# Altium project T3-COM1-2.PrjPcb (part 3 of 6)

## Sheet Schematic1_2.SchDoc
size 594 x 420 mm; SchematicName: Schematic1; PageName: 2; CmpIndex: 3; Symbol name: A2-LIST-2N-1-GA.1; SymIndex: 3
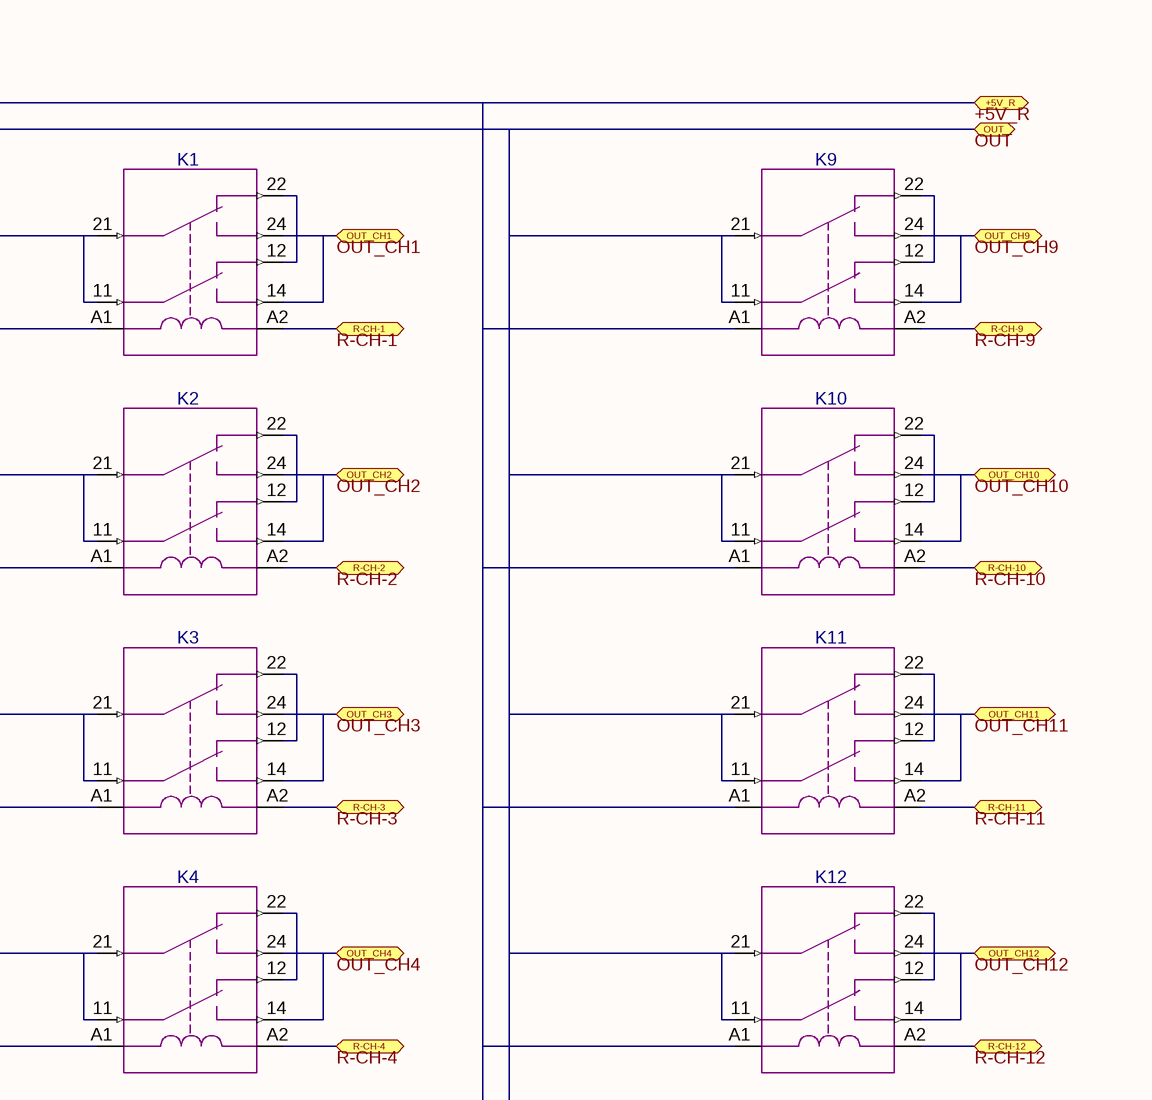
[diagram p5: Schematic1_2.SchDoc, top left]
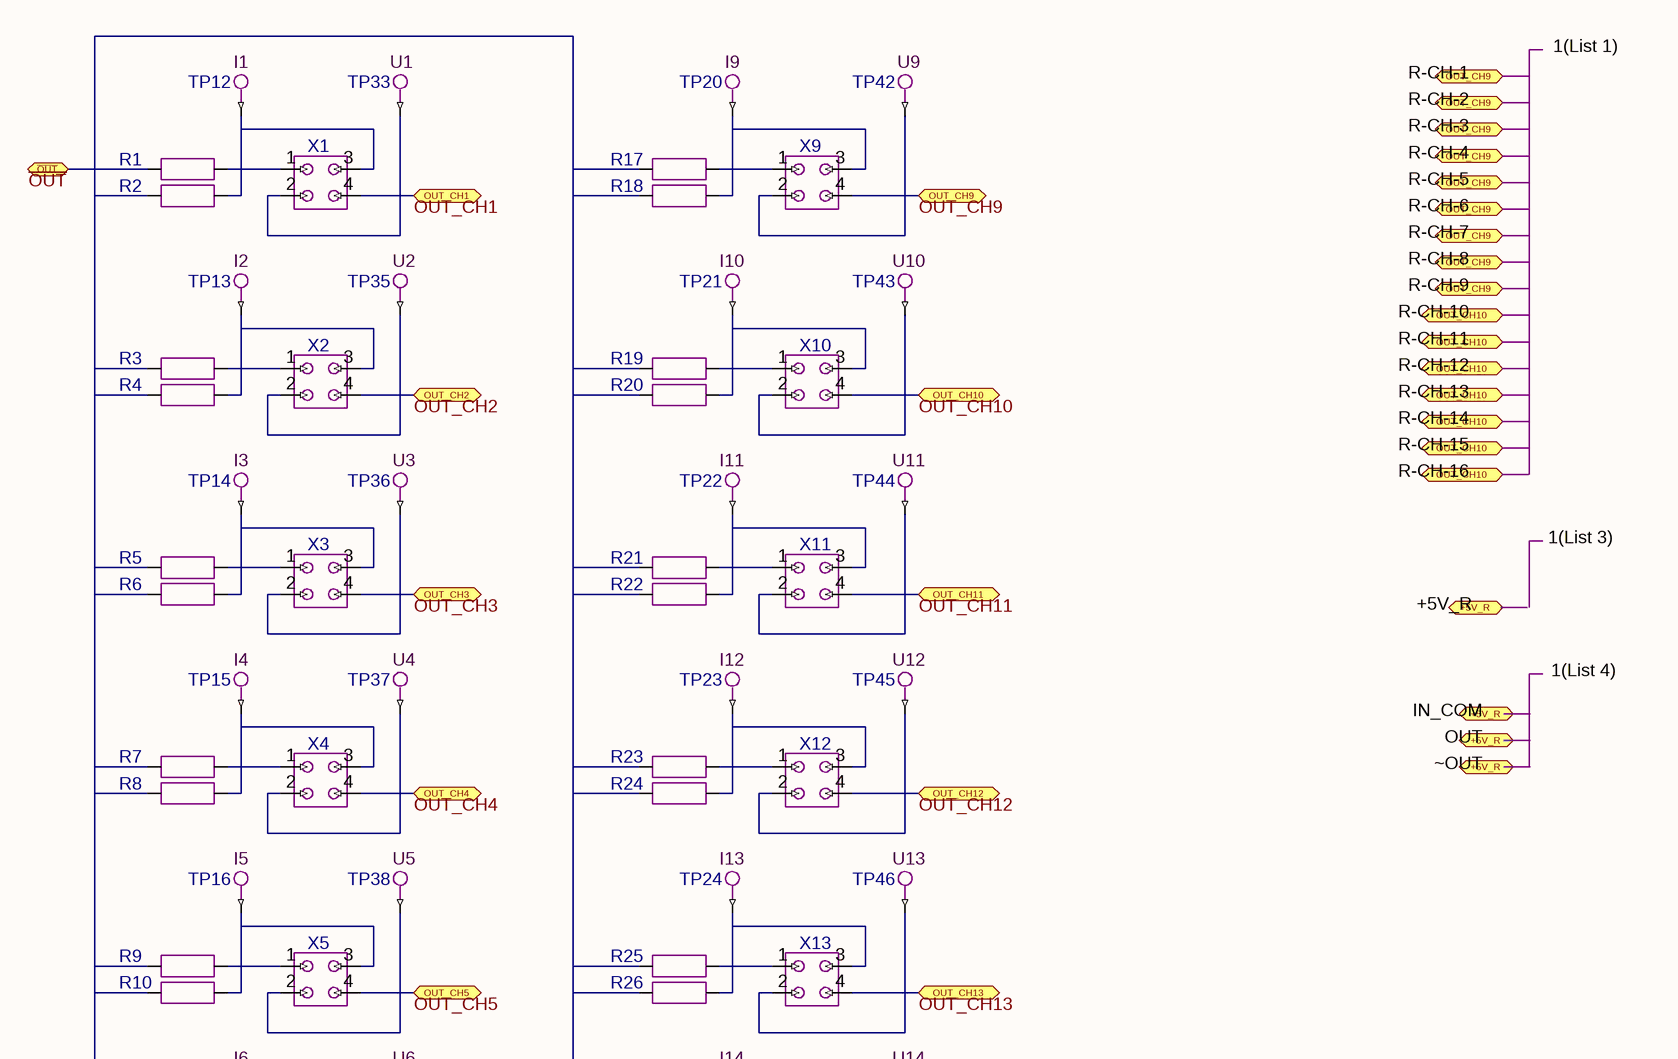
[diagram p6: Schematic1_2.SchDoc, top right]
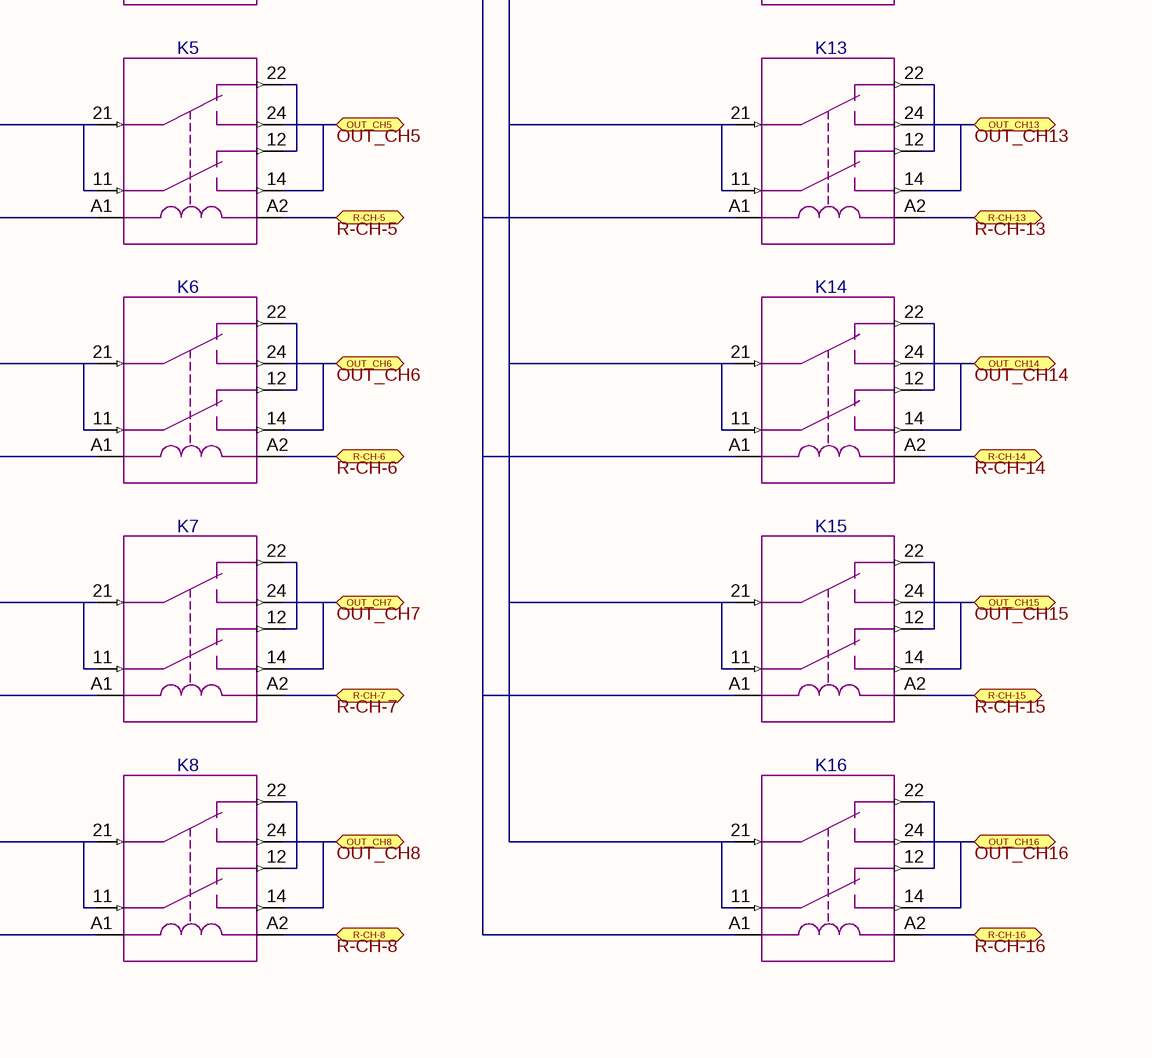
[diagram p7: Schematic1_2.SchDoc, bottom left]
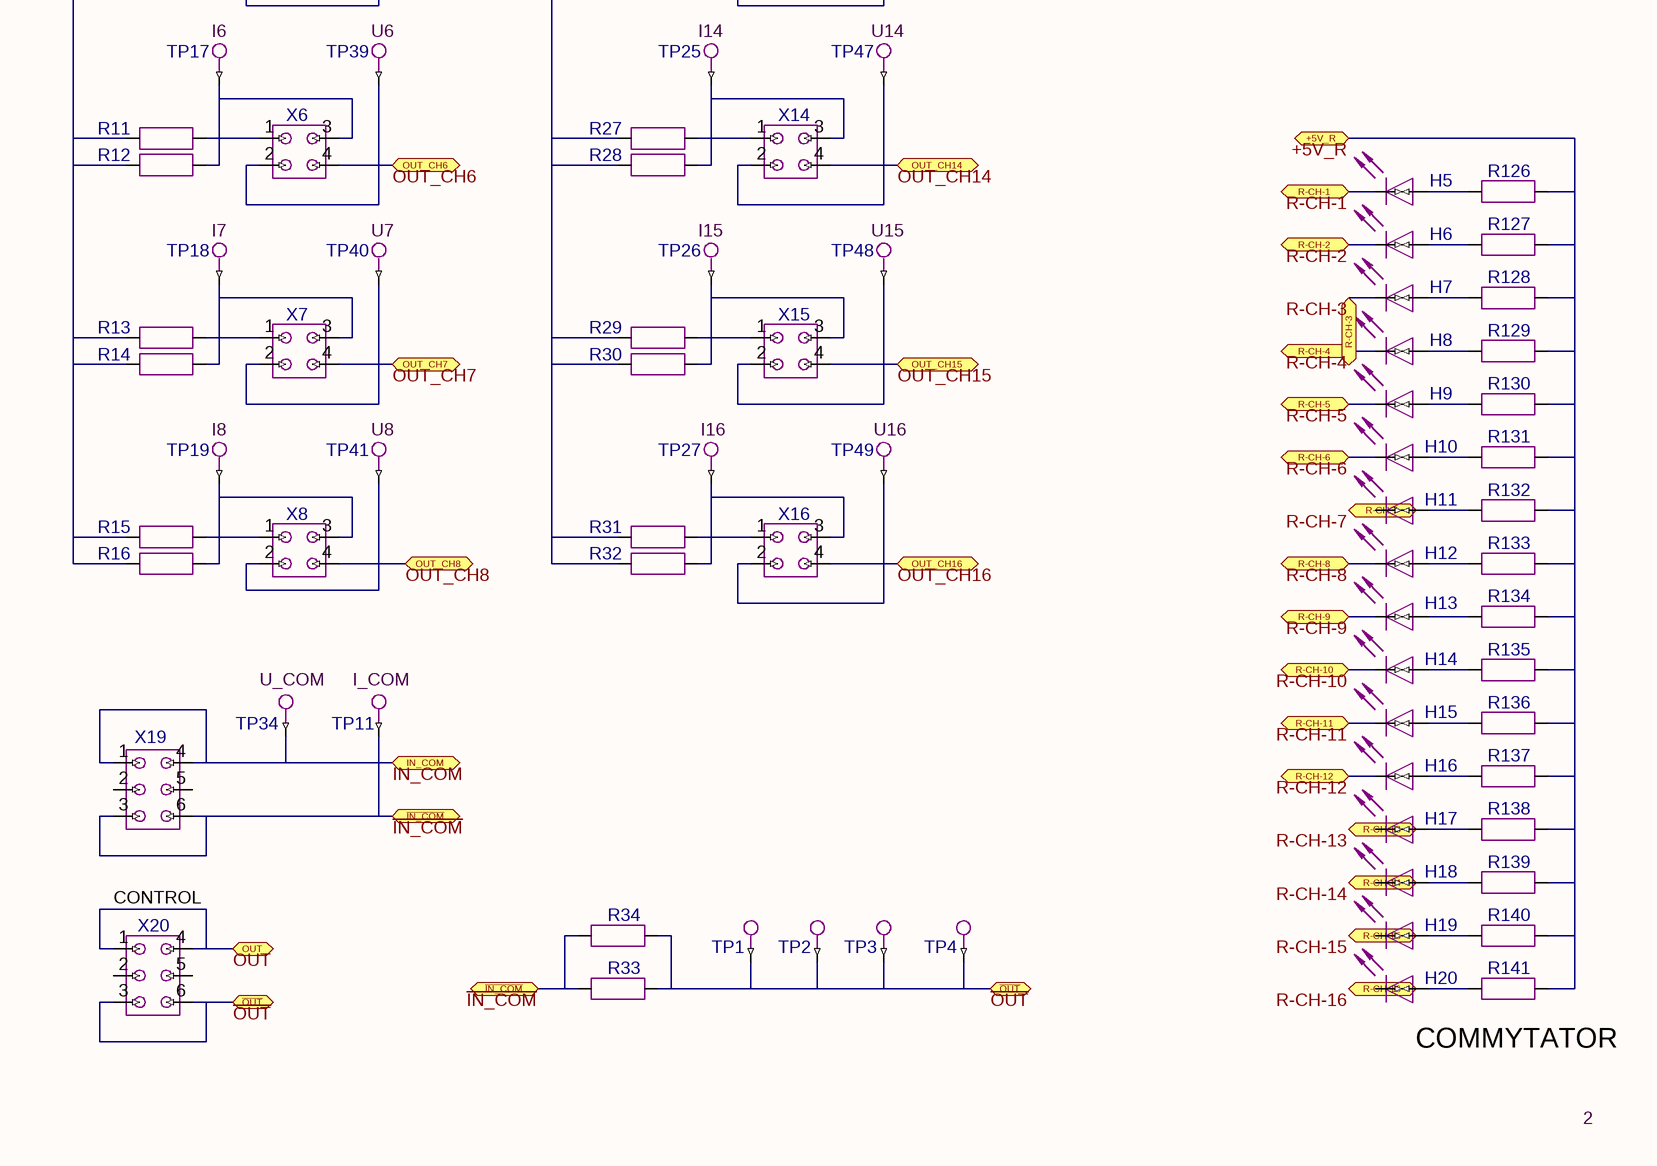
[diagram p8: Schematic1_2.SchDoc, bottom right]

### Parts
H5  LED 2X1.2MM 640NM RD WTR CLR SMD  (value not drawn)
H6  LED 2X1.2MM 640NM RD WTR CLR SMD  (value not drawn)
H7  LED 2X1.2MM 640NM RD WTR CLR SMD  (value not drawn)
H8  LED 2X1.2MM 640NM RD WTR CLR SMD  (value not drawn)
H9  LED 2X1.2MM 640NM RD WTR CLR SMD  (value not drawn)
H10  LED 2X1.2MM 640NM RD WTR CLR SMD  (value not drawn)
H11  LED 2X1.2MM 640NM RD WTR CLR SMD  (value not drawn)
H12  LED 2X1.2MM 640NM RD WTR CLR SMD  (value not drawn)
H13  LED 2X1.2MM 640NM RD WTR CLR SMD  (value not drawn)
H14  LED 2X1.2MM 640NM RD WTR CLR SMD  (value not drawn)
H15  LED 2X1.2MM 640NM RD WTR CLR SMD  (value not drawn)
H16  LED 2X1.2MM 640NM RD WTR CLR SMD  (value not drawn)
H17  LED 2X1.2MM 640NM RD WTR CLR SMD  (value not drawn)
H18  LED 2X1.2MM 640NM RD WTR CLR SMD  (value not drawn)
H19  LED 2X1.2MM 640NM RD WTR CLR SMD  (value not drawn)
H20  LED 2X1.2MM 640NM RD WTR CLR SMD  (value not drawn)
K1  RELAY GEN PURPOSE SPDT 16A 5V  (value not drawn)
K2  RELAY GEN PURPOSE SPDT 16A 5V  (value not drawn)
K3  RELAY GEN PURPOSE SPDT 16A 5V  (value not drawn)
K4  RELAY GEN PURPOSE SPDT 16A 5V  (value not drawn)
K5  RELAY GEN PURPOSE SPDT 16A 5V  (value not drawn)
K6  RELAY GEN PURPOSE SPDT 16A 5V  (value not drawn)
K7  RELAY GEN PURPOSE SPDT 16A 5V  (value not drawn)
K8  RELAY GEN PURPOSE SPDT 16A 5V  (value not drawn)
K9  RELAY GEN PURPOSE SPDT 16A 5V  (value not drawn)
K10  RELAY GEN PURPOSE SPDT 16A 5V  (value not drawn)
K11  RELAY GEN PURPOSE SPDT 16A 5V  (value not drawn)
K12  RELAY GEN PURPOSE SPDT 16A 5V  (value not drawn)
K13  RELAY GEN PURPOSE SPDT 16A 5V  (value not drawn)
K14  RELAY GEN PURPOSE SPDT 16A 5V  (value not drawn)
K15  RELAY GEN PURPOSE SPDT 16A 5V  (value not drawn)
K16  RELAY GEN PURPOSE SPDT 16A 5V  (value not drawn)
R1  RES 0.1 OHM 1% 2W 2512  (value not drawn)
R2  RES 0.1 OHM 1% 2W 2512  (value not drawn)
R3  RES 0.1 OHM 1% 2W 2512  (value not drawn)
R4  RES 0.1 OHM 1% 2W 2512  (value not drawn)
R5  RES 0.1 OHM 1% 2W 2512  (value not drawn)
R6  RES 0.1 OHM 1% 2W 2512  (value not drawn)
R7  RES 0.1 OHM 1% 2W 2512  (value not drawn)
R8  RES 0.1 OHM 1% 2W 2512  (value not drawn)
R9  RES 0.1 OHM 1% 2W 2512  (value not drawn)
R10  RES 0.1 OHM 1% 2W 2512  (value not drawn)
R11  RES 0.1 OHM 1% 2W 2512  (value not drawn)
R12  RES 0.1 OHM 1% 2W 2512  (value not drawn)
R13  RES 0.1 OHM 1% 2W 2512  (value not drawn)
R14  RES 0.1 OHM 1% 2W 2512  (value not drawn)
R15  RES 0.1 OHM 1% 2W 2512  (value not drawn)
R16  RES 0.1 OHM 1% 2W 2512  (value not drawn)
R17  RES 0.1 OHM 1% 2W 2512  (value not drawn)
R18  RES 0.1 OHM 1% 2W 2512  (value not drawn)
R19  RES 0.1 OHM 1% 2W 2512  (value not drawn)
R20  RES 0.1 OHM 1% 2W 2512  (value not drawn)
R21  RES 0.1 OHM 1% 2W 2512  (value not drawn)
R22  RES 0.1 OHM 1% 2W 2512  (value not drawn)
R23  RES 0.1 OHM 1% 2W 2512  (value not drawn)
R24  RES 0.1 OHM 1% 2W 2512  (value not drawn)
R25  RES 0.1 OHM 1% 2W 2512  (value not drawn)
R26  RES 0.1 OHM 1% 2W 2512  (value not drawn)
R27  RES 0.1 OHM 1% 2W 2512  (value not drawn)
R28  RES 0.1 OHM 1% 2W 2512  (value not drawn)
R29  RES 0.1 OHM 1% 2W 2512  (value not drawn)
R30  RES 0.1 OHM 1% 2W 2512  (value not drawn)
R31  RES 0.1 OHM 1% 2W 2512  (value not drawn)
R32  RES 0.1 OHM 1% 2W 2512  (value not drawn)
R33  RES 0.1 OHM 1% 2W 2512  (value not drawn)
R34  RES 0.1 OHM 1% 2W 2512  (value not drawn)
R126  RES 620 OHM 1/10W 1% 0603 SMD  (value not drawn)
R127  RES 620 OHM 1/10W 1% 0603 SMD  (value not drawn)
R128  RES 620 OHM 1/10W 1% 0603 SMD  (value not drawn)
R129  RES 620 OHM 1/10W 1% 0603 SMD  (value not drawn)
R130  RES 620 OHM 1/10W 1% 0603 SMD  (value not drawn)
R131  RES 620 OHM 1/10W 1% 0603 SMD  (value not drawn)
R132  RES 620 OHM 1/10W 1% 0603 SMD  (value not drawn)
R133  RES 620 OHM 1/10W 1% 0603 SMD  (value not drawn)
R134  RES 620 OHM 1/10W 1% 0603 SMD  (value not drawn)
R135  RES 620 OHM 1/10W 1% 0603 SMD  (value not drawn)
R136  RES 620 OHM 1/10W 1% 0603 SMD  (value not drawn)
R137  RES 620 OHM 1/10W 1% 0603 SMD  (value not drawn)
R138  RES 620 OHM 1/10W 1% 0603 SMD  (value not drawn)
R139  RES 620 OHM 1/10W 1% 0603 SMD  (value not drawn)
R140  RES 620 OHM 1/10W 1% 0603 SMD  (value not drawn)
R141  RES 620 OHM 1/10W 1% 0603 SMD  (value not drawn)
TP1  TEST POINT PC MULTI PURPOSE BLK  (value not drawn)
TP2  TEST POINT PC MULTI PURPOSE BLK  (value not drawn)
TP3  TEST POINT PC MULTI PURPOSE BLK  (value not drawn)
TP4  TEST POINT PC MULTI PURPOSE BLK  (value not drawn)
TP11  TEST POINT PC MULTIPURPOSE BRWN  (value not drawn)
TP12  TEST POINT PC MULTIPURPOSE BRWN  (value not drawn)
TP13  TEST POINT PC MULTIPURPOSE BRWN  (value not drawn)
TP14  TEST POINT PC MULTIPURPOSE BRWN  (value not drawn)
TP15  TEST POINT PC MULTIPURPOSE BRWN  (value not drawn)
TP16  TEST POINT PC MULTIPURPOSE BRWN  (value not drawn)
TP17  TEST POINT PC MULTIPURPOSE BRWN  (value not drawn)
TP18  TEST POINT PC MULTIPURPOSE BRWN  (value not drawn)
TP19  TEST POINT PC MULTIPURPOSE BRWN  (value not drawn)
TP20  TEST POINT PC MULTIPURPOSE BRWN  (value not drawn)
TP21  TEST POINT PC MULTIPURPOSE BRWN  (value not drawn)
TP22  TEST POINT PC MULTIPURPOSE BRWN  (value not drawn)
TP23  TEST POINT PC MULTIPURPOSE BRWN  (value not drawn)
TP24  TEST POINT PC MULTIPURPOSE BRWN  (value not drawn)
TP25  TEST POINT PC MULTIPURPOSE BRWN  (value not drawn)
TP26  TEST POINT PC MULTIPURPOSE BRWN  (value not drawn)
TP27  TEST POINT PC MULTIPURPOSE BRWN  (value not drawn)
TP33  TEST POINT PC MULTI PURPOSE ORG  (value not drawn)
TP34  TEST POINT PC MULTI PURPOSE ORG  (value not drawn)
TP35  TEST POINT PC MULTI PURPOSE ORG  (value not drawn)
TP36  TEST POINT PC MULTI PURPOSE ORG  (value not drawn)
TP37  TEST POINT PC MULTI PURPOSE ORG  (value not drawn)
TP38  TEST POINT PC MULTI PURPOSE ORG  (value not drawn)
TP39  TEST POINT PC MULTI PURPOSE ORG  (value not drawn)
TP40  TEST POINT PC MULTI PURPOSE ORG  (value not drawn)
TP41  TEST POINT PC MULTI PURPOSE ORG  (value not drawn)
TP42  TEST POINT PC MULTI PURPOSE ORG  (value not drawn)
TP43  TEST POINT PC MULTI PURPOSE ORG  (value not drawn)
TP44  TEST POINT PC MULTI PURPOSE ORG  (value not drawn)
TP45  TEST POINT PC MULTI PURPOSE ORG  (value not drawn)
TP46  TEST POINT PC MULTI PURPOSE ORG  (value not drawn)
TP47  TEST POINT PC MULTI PURPOSE ORG  (value not drawn)
TP48  TEST POINT PC MULTI PURPOSE ORG  (value not drawn)
TP49  TEST POINT PC MULTI PURPOSE ORG  (value not drawn)
X1  CONN HEADER 4POS 4.2MM R/A TIN  (value not drawn)
X2  CONN HEADER 4POS 4.2MM R/A TIN  (value not drawn)
X3  CONN HEADER 4POS 4.2MM R/A TIN  (value not drawn)
X4  CONN HEADER 4POS 4.2MM R/A TIN  (value not drawn)
X5  CONN HEADER 4POS 4.2MM R/A TIN  (value not drawn)
X6  CONN HEADER 4POS 4.2MM R/A TIN  (value not drawn)
X7  CONN HEADER 4POS 4.2MM R/A TIN  (value not drawn)
X8  CONN HEADER 4POS 4.2MM R/A TIN  (value not drawn)
X9  CONN HEADER 4POS 4.2MM R/A TIN  (value not drawn)
X10  CONN HEADER 4POS 4.2MM R/A TIN  (value not drawn)
X11  CONN HEADER 4POS 4.2MM R/A TIN  (value not drawn)
X12  CONN HEADER 4POS 4.2MM R/A TIN  (value not drawn)
X13  CONN HEADER 4POS 4.2MM R/A TIN  (value not drawn)
X14  CONN HEADER 4POS 4.2MM R/A TIN  (value not drawn)
X15  CONN HEADER 4POS 4.2MM R/A TIN  (value not drawn)
X16  CONN HEADER 4POS 4.2MM R/A TIN  (value not drawn)
X19  CONN HEADER 6POS 4.2MM VERT TIN  (value not drawn)
X20  CONN HEADER 6POS 4.2MM VERT TIN  (value not drawn)

### Ports
+5V_R, IN_COM, OUT, OUT_CH1, OUT_CH2, OUT_CH3, OUT_CH4, OUT_CH5, OUT_CH6, OUT_CH7, OUT_CH8, OUT_CH9, OUT_CH10, OUT_CH11, OUT_CH12, OUT_CH13, OUT_CH14, OUT_CH15, OUT_CH16, R-CH-1, R-CH-2, R-CH-3, R-CH-4, R-CH-5, R-CH-6, R-CH-7, R-CH-8, R-CH-9, R-CH-10, R-CH-11, R-CH-12, R-CH-13, R-CH-14, R-CH-15, R-CH-16, ~{IN_COM}, ~{OUT}

### Nets
+5V_R: K1.A1 K2.A1 K3.A1 K4.A1 K5.A1 K6.A1 K7.A1 K8.A1 K9.A1 K10.A1 K11.A1 K12.A1 K13.A1 K14.A1 K15.A1 K16.A1 R126.2 R127.2 R128.2 R129.2 R130.2 R131.2 R132.2 R133.2 R134.2 R135.2 R136.2 R137.2 R138.2 R139.2 R140.2 R141.2 ; port +5V_R
~{IN_COM}: R33.1 R34.1 TP11.1 X19.3 X19.6 ; port ~{IN_COM}
IN_COM: TP34.1 X19.1 X19.4 ; port IN_COM
~{OUT}: R1.1 R2.1 R3.1 R4.1 R5.1 R6.1 R7.1 R8.1 R9.1 R10.1 R11.1 R12.1 R13.1 R14.1 R15.1 R16.1 R17.1 R18.1 R19.1 R20.1 R21.1 R22.1 R23.1 R24.1 R25.1 R26.1 R27.1 R28.1 R29.1 R30.1 R31.1 R32.1 R33.2 R34.2 TP1.1 TP2.1 TP3.1 TP4.1 X20.3 X20.6 ; port ~{OUT}
OUT: K1.11(K11) K1.21(K21) K2.11(K11) K2.21(K21) K3.11(K11) K3.21(K21) K4.11(K11) K4.21(K21) K5.11(K11) K5.21(K21) K6.11(K11) K6.21(K21) K7.11(K11) K7.21(K21) K8.11(K11) K8.21(K21) K9.11(K11) K9.21(K21) K10.11(K11) K10.21(K21) K11.11(K11) K11.21(K21) K12.11(K11) K12.21(K21) K13.11(K11) K13.21(K21) K14.11(K11) K14.21(K21) K15.11(K11) K15.21(K21) K16.11(K11) K16.21(K21) X20.1 X20.4 ; port OUT
OUT_CH1: K1.14(K14) K1.24(K24) TP33.1 X1.2 X1.4 ; port OUT_CH1
OUT_CH2: K2.14(K14) K2.24(K24) TP35.1 X2.2 X2.4 ; port OUT_CH2
OUT_CH3: K3.14(K14) K3.24(K24) TP36.1 X3.2 X3.4 ; port OUT_CH3
OUT_CH4: K4.14(K14) K4.24(K24) TP37.1 X4.2 X4.4 ; port OUT_CH4
OUT_CH5: K5.14(K14) K5.24(K24) TP38.1 X5.2 X5.4 ; port OUT_CH5
OUT_CH6: K6.14(K14) K6.24(K24) TP39.1 X6.2 X6.4 ; port OUT_CH6
OUT_CH7: K7.14(K14) K7.24(K24) TP40.1 X7.2 X7.4 ; port OUT_CH7
OUT_CH8: K8.14(K14) K8.24(K24) TP41.1 X8.2 X8.4 ; port OUT_CH8
OUT_CH9: K9.14(K14) K9.24(K24) TP42.1 X9.2 X9.4 ; port OUT_CH9
OUT_CH10: K10.14(K14) K10.24(K24) TP43.1 X10.2 X10.4 ; port OUT_CH10
OUT_CH11: K11.14(K14) K11.24(K24) TP44.1 X11.2 X11.4 ; port OUT_CH11
OUT_CH12: K12.14(K14) K12.24(K24) TP45.1 X12.2 X12.4 ; port OUT_CH12
OUT_CH13: K13.14(K14) K13.24(K24) TP46.1 X13.2 X13.4 ; port OUT_CH13
OUT_CH14: K14.14(K14) K14.24(K24) TP47.1 X14.2 X14.4 ; port OUT_CH14
OUT_CH15: K15.14(K14) K15.24(K24) TP48.1 X15.2 X15.4 ; port OUT_CH15
OUT_CH16: K16.14(K14) K16.24(K24) TP49.1 X16.2 X16.4 ; port OUT_CH16
R-CH-1: H5.2(C) K1.A2 ; port R-CH-1
R-CH-2: H6.2(C) K2.A2 ; port R-CH-2
R-CH-3: H7.2(C) K3.A2 ; port R-CH-3
R-CH-4: H8.2(C) K4.A2 ; port R-CH-4
R-CH-5: H9.2(C) K5.A2 ; port R-CH-5
R-CH-6: H10.2(C) K6.A2 ; port R-CH-6
R-CH-7: H11.2(C) K7.A2 ; port R-CH-7
R-CH-8: H12.2(C) K8.A2 ; port R-CH-8
R-CH-9: H13.2(C) K9.A2 ; port R-CH-9
R-CH-10: H14.2(C) K10.A2 ; port R-CH-10
R-CH-11: H15.2(C) K11.A2 ; port R-CH-11
R-CH-12: H16.2(C) K12.A2 ; port R-CH-12
R-CH-13: H17.2(C) K13.A2 ; port R-CH-13
R-CH-14: H18.2(C) K14.A2 ; port R-CH-14
R-CH-15: H19.2(C) K15.A2 ; port R-CH-15
R-CH-16: H20.2(C) K16.A2 ; port R-CH-16
NetH5_1: H5.1(A) R126.1
NetH6_1: H6.1(A) R127.1
NetH7_1: H7.1(A) R128.1
NetH8_1: H8.1(A) R129.1
NetH9_1: H9.1(A) R130.1
NetH10_1: H10.1(A) R131.1
NetH11_1: H11.1(A) R132.1
NetH12_1: H12.1(A) R133.1
NetH13_1: H13.1(A) R134.1
NetH14_1: H14.1(A) R135.1
NetH15_1: H15.1(A) R136.1
NetH16_1: H16.1(A) R137.1
NetH17_1: H17.1(A) R138.1
NetH18_1: H18.1(A) R139.1
NetH19_1: H19.1(A) R140.1
NetH20_1: H20.1(A) R141.1
NetK1_12: K1.12(K12) K1.22(K22)
NetK2_12: K2.12(K12) K2.22(K22)
NetK3_12: K3.12(K12) K3.22(K22)
NetK4_12: K4.12(K12) K4.22(K22)
NetK5_12: K5.12(K12) K5.22(K22)
NetK6_12: K6.12(K12) K6.22(K22)
NetK7_12: K7.12(K12) K7.22(K22)
NetK8_12: K8.12(K12) K8.22(K22)
NetK9_12: K9.12(K12) K9.22(K22)
NetK10_12: K10.12(K12) K10.22(K22)
NetK11_12: K11.12(K12) K11.22(K22)
NetK12_12: K12.12(K12) K12.22(K22)
NetK13_12: K13.12(K12) K13.22(K22)
NetK14_12: K14.12(K12) K14.22(K22)
NetK15_12: K15.12(K12) K15.22(K22)
NetK16_12: K16.12(K12) K16.22(K22)
NetR1_2: R1.2 R2.2 TP12.1 X1.1 X1.3
NetR3_2: R3.2 R4.2 TP13.1 X2.1 X2.3
NetR5_2: R5.2 R6.2 TP14.1 X3.1 X3.3
NetR7_2: R7.2 R8.2 TP15.1 X4.1 X4.3
NetR9_2: R9.2 R10.2 TP16.1 X5.1 X5.3
NetR11_2: R11.2 R12.2 TP17.1 X6.1 X6.3
NetR13_2: R13.2 R14.2 TP18.1 X7.1 X7.3
NetR15_2: R15.2 R16.2 TP19.1 X8.1 X8.3
NetR17_2: R17.2 R18.2 TP20.1 X9.1 X9.3
NetR19_2: R19.2 R20.2 TP21.1 X10.1 X10.3
NetR21_2: R21.2 R22.2 TP22.1 X11.1 X11.3
NetR23_2: R23.2 R24.2 TP23.1 X12.1 X12.3
NetR25_2: R25.2 R26.2 TP24.1 X13.1 X13.3
NetR27_2: R27.2 R28.2 TP25.1 X14.1 X14.3
NetR29_2: R29.2 R30.2 TP26.1 X15.1 X15.3
NetR31_2: R31.2 R32.2 TP27.1 X16.1 X16.3

Not connected (* = marked no-connect by the designer): X19 2 5; X20 2 5

### Notes on the sheet
- 1(List 1)
- (near TP12) I1
- (near TP33) U1
- (near TP20) I9
- (near TP42) U9
- R-CH-1
- R-CH-2
- R-CH-3
- R-CH-4
- R-CH-5
- R-CH-6
- R-CH-7
- (near TP13) I2
- (near TP35) U2
- (near TP21) I10
- (near TP43) U10
- R-CH-8
- R-CH-9
- R-CH-10
- R-CH-11
- R-CH-12
- R-CH-13
- R-CH-14
- R-CH-15
- (near TP14) I3
- (near TP36) U3
- (near TP22) I11
- (near TP44) U11
- R-CH-16
- 1(List 3)
- +5V_R
- (near TP15) I4
- (near TP37) U4
- (near TP23) I12
- (near TP45) U12
- IN_COM
- 1(List 4)
- OUT
- ~OUT
- (near TP16) I5
- (near TP38) U5
- (near TP24) I13
- (near TP46) U13
- (near TP17) I6
- (near TP39) U6
- (near TP25) I14
- (near TP47) U14
- (near TP18) I7
- (near TP40) U7
- (near TP26) I15
- (near TP48) U15
- (near TP19) I8
- (near TP41) U8
- (near TP27) I16
- (near TP49) U16
- (near TP34) U_COM
- (near TP11) I_COM
- (near X20) CONTROL
- COMMYTATOR
- 2

### Library data of the parts
H5 = LED 2X1.2MM 640NM RD WTR CLR SMD: APT2012SRCPRV; Part Label: RED/20mA/100mcd; Cell Name: 0805-STANDART-2012-SVET; CmpIndex: 65; Ref Designator: H5; Symbol name: SVETODIODE_1A_2K.1; SymIndex: 16; Part Name: LED 2X1.2MM 640NM RD WTR CLR SMD; Part Number: APT2012SRCPRV
H6 = LED 2X1.2MM 640NM RD WTR CLR SMD: APT2012SRCPRV; Part Label: RED/20mA/100mcd; Cell Name: 0805-STANDART-2012-SVET; CmpIndex: 100; Ref Designator: H6; Symbol name: SVETODIODE_1A_2K.1; SymIndex: 16; Part Name: LED 2X1.2MM 640NM RD WTR CLR SMD; Part Number: APT2012SRCPRV
H7 = LED 2X1.2MM 640NM RD WTR CLR SMD: APT2012SRCPRV; Part Label: RED/20mA/100mcd; Cell Name: 0805-STANDART-2012-SVET; CmpIndex: 135; Ref Designator: H7; Symbol name: SVETODIODE_1A_2K.1; SymIndex: 16; Part Name: LED 2X1.2MM 640NM RD WTR CLR SMD; Part Number: APT2012SRCPRV
H8 = LED 2X1.2MM 640NM RD WTR CLR SMD: APT2012SRCPRV; Part Label: RED/20mA/100mcd; Cell Name: 0805-STANDART-2012-SVET; CmpIndex: 137; Ref Designator: H8; Symbol name: SVETODIODE_1A_2K.1; SymIndex: 16; Part Name: LED 2X1.2MM 640NM RD WTR CLR SMD; Part Number: APT2012SRCPRV
H9 = LED 2X1.2MM 640NM RD WTR CLR SMD: APT2012SRCPRV; Part Label: RED/20mA/100mcd; Cell Name: 0805-STANDART-2012-SVET; CmpIndex: 139; Ref Designator: H9; Symbol name: SVETODIODE_1A_2K.1; SymIndex: 16; Part Name: LED 2X1.2MM 640NM RD WTR CLR SMD; Part Number: APT2012SRCPRV
H10 = LED 2X1.2MM 640NM RD WTR CLR SMD: APT2012SRCPRV; Part Label: RED/20mA/100mcd; Cell Name: 0805-STANDART-2012-SVET; CmpIndex: 141; Ref Designator: H10; Symbol name: SVETODIODE_1A_2K.1; SymIndex: 16; Part Name: LED 2X1.2MM 640NM RD WTR CLR SMD; Part Number: APT2012SRCPRV
H11 = LED 2X1.2MM 640NM RD WTR CLR SMD: APT2012SRCPRV; Part Label: RED/20mA/100mcd; Cell Name: 0805-STANDART-2012-SVET; CmpIndex: 143; Ref Designator: H11; Symbol name: SVETODIODE_1A_2K.1; SymIndex: 16; Part Name: LED 2X1.2MM 640NM RD WTR CLR SMD; Part Number: APT2012SRCPRV
H12 = LED 2X1.2MM 640NM RD WTR CLR SMD: APT2012SRCPRV; Part Label: RED/20mA/100mcd; Cell Name: 0805-STANDART-2012-SVET; CmpIndex: 168; Ref Designator: H12; Symbol name: SVETODIODE_1A_2K.1; SymIndex: 16; Part Name: LED 2X1.2MM 640NM RD WTR CLR SMD; Part Number: APT2012SRCPRV
H13 = LED 2X1.2MM 640NM RD WTR CLR SMD: APT2012SRCPRV; Part Label: RED/20mA/100mcd; Cell Name: 0805-STANDART-2012-SVET; CmpIndex: 170; Ref Designator: H13; Symbol name: SVETODIODE_1A_2K.1; SymIndex: 16; Part Name: LED 2X1.2MM 640NM RD WTR CLR SMD; Part Number: APT2012SRCPRV
H14 = LED 2X1.2MM 640NM RD WTR CLR SMD: APT2012SRCPRV; Part Label: RED/20mA/100mcd; Cell Name: 0805-STANDART-2012-SVET; CmpIndex: 172; Ref Designator: H14; Symbol name: SVETODIODE_1A_2K.1; SymIndex: 16; Part Name: LED 2X1.2MM 640NM RD WTR CLR SMD; Part Number: APT2012SRCPRV
H15 = LED 2X1.2MM 640NM RD WTR CLR SMD: APT2012SRCPRV; Part Label: RED/20mA/100mcd; Cell Name: 0805-STANDART-2012-SVET; CmpIndex: 174; Ref Designator: H15; Symbol name: SVETODIODE_1A_2K.1; SymIndex: 16; Part Name: LED 2X1.2MM 640NM RD WTR CLR SMD; Part Number: APT2012SRCPRV
H16 = LED 2X1.2MM 640NM RD WTR CLR SMD: APT2012SRCPRV; Part Label: RED/20mA/100mcd; Cell Name: 0805-STANDART-2012-SVET; CmpIndex: 176; Ref Designator: H16; Symbol name: SVETODIODE_1A_2K.1; SymIndex: 16; Part Name: LED 2X1.2MM 640NM RD WTR CLR SMD; Part Number: APT2012SRCPRV
H17 = LED 2X1.2MM 640NM RD WTR CLR SMD: APT2012SRCPRV; Part Label: RED/20mA/100mcd; Cell Name: 0805-STANDART-2012-SVET; CmpIndex: 178; Ref Designator: H17; Symbol name: SVETODIODE_1A_2K.1; SymIndex: 16; Part Name: LED 2X1.2MM 640NM RD WTR CLR SMD; Part Number: APT2012SRCPRV
H18 = LED 2X1.2MM 640NM RD WTR CLR SMD: APT2012SRCPRV; Part Label: RED/20mA/100mcd; Cell Name: 0805-STANDART-2012-SVET; CmpIndex: 181; Ref Designator: H18; Symbol name: SVETODIODE_1A_2K.1; SymIndex: 16; Part Name: LED 2X1.2MM 640NM RD WTR CLR SMD; Part Number: APT2012SRCPRV
H19 = LED 2X1.2MM 640NM RD WTR CLR SMD: APT2012SRCPRV; Part Label: RED/20mA/100mcd; Cell Name: 0805-STANDART-2012-SVET; CmpIndex: 186; Ref Designator: H19; Symbol name: SVETODIODE_1A_2K.1; SymIndex: 16; Part Name: LED 2X1.2MM 640NM RD WTR CLR SMD; Part Number: APT2012SRCPRV
H20 = LED 2X1.2MM 640NM RD WTR CLR SMD: APT2012SRCPRV; Part Label: RED/20mA/100mcd; Cell Name: 0805-STANDART-2012-SVET; CmpIndex: 193; Ref Designator: H20; Symbol name: SVETODIODE_1A_2K.1; SymIndex: 16; Part Name: LED 2X1.2MM 640NM RD WTR CLR SMD; Part Number: APT2012SRCPRV
K1 = RELAY GEN PURPOSE SPDT 16A 5V: RT314005; Part Label: 5VDC/16A/400V-1FORM_C; Cell Name: RT-2-TE-YNIVERSAL; CmpIndex: 60; Ref Designator: K1; Symbol name: RT-2-TE_CONNECTIVITI.1; SymIndex: 12; Part Name: RELAY GEN PURPOSE SPDT 16A 5V; Part Number: RT314005
K2 = RELAY GEN PURPOSE SPDT 16A 5V: RT314005; Part Label: 5VDC/16A/400V-1FORM_C; Cell Name: RT-2-TE-YNIVERSAL; CmpIndex: 9; Ref Designator: K2; Symbol name: RT-2-TE_CONNECTIVITI.1; SymIndex: 12; Part Name: RELAY GEN PURPOSE SPDT 16A 5V; Part Number: RT314005
K3 = RELAY GEN PURPOSE SPDT 16A 5V: RT314005; Part Label: 5VDC/16A/400V-1FORM_C; Cell Name: RT-2-TE-YNIVERSAL; CmpIndex: 14; Ref Designator: K3; Symbol name: RT-2-TE_CONNECTIVITI.1; SymIndex: 12; Part Name: RELAY GEN PURPOSE SPDT 16A 5V; Part Number: RT314005
K4 = RELAY GEN PURPOSE SPDT 16A 5V: RT314005; Part Label: 5VDC/16A/400V-1FORM_C; Cell Name: RT-2-TE-YNIVERSAL; CmpIndex: 19; Ref Designator: K4; Symbol name: RT-2-TE_CONNECTIVITI.1; SymIndex: 12; Part Name: RELAY GEN PURPOSE SPDT 16A 5V; Part Number: RT314005
K5 = RELAY GEN PURPOSE SPDT 16A 5V: RT314005; Part Label: 5VDC/16A/400V-1FORM_C; Cell Name: RT-2-TE-YNIVERSAL; CmpIndex: 37; Ref Designator: K5; Symbol name: RT-2-TE_CONNECTIVITI.1; SymIndex: 12; Part Name: RELAY GEN PURPOSE SPDT 16A 5V; Part Number: RT314005
K6 = RELAY GEN PURPOSE SPDT 16A 5V: RT314005; Part Label: 5VDC/16A/400V-1FORM_C; Cell Name: RT-2-TE-YNIVERSAL; CmpIndex: 51; Ref Designator: K6; Symbol name: RT-2-TE_CONNECTIVITI.1; SymIndex: 12; Part Name: RELAY GEN PURPOSE SPDT 16A 5V; Part Number: RT314005
K7 = RELAY GEN PURPOSE SPDT 16A 5V: RT314005; Part Label: 5VDC/16A/400V-1FORM_C; Cell Name: RT-2-TE-YNIVERSAL; CmpIndex: 56; Ref Designator: K7; Symbol name: RT-2-TE_CONNECTIVITI.1; SymIndex: 12; Part Name: RELAY GEN PURPOSE SPDT 16A 5V; Part Number: RT314005
K8 = RELAY GEN PURPOSE SPDT 16A 5V: RT314005; Part Label: 5VDC/16A/400V-1FORM_C; Cell Name: RT-2-TE-YNIVERSAL; CmpIndex: 146; Ref Designator: K8; Symbol name: RT-2-TE_CONNECTIVITI.1; SymIndex: 12; Part Name: RELAY GEN PURPOSE SPDT 16A 5V; Part Number: RT314005
K9 = RELAY GEN PURPOSE SPDT 16A 5V: RT314005; Part Label: 5VDC/16A/400V-1FORM_C; Cell Name: RT-2-TE-YNIVERSAL; CmpIndex: 151; Ref Designator: K9; Symbol name: RT-2-TE_CONNECTIVITI.1; SymIndex: 12; Part Name: RELAY GEN PURPOSE SPDT 16A 5V; Part Number: RT314005
K10 = RELAY GEN PURPOSE SPDT 16A 5V: RT314005; Part Label: 5VDC/16A/400V-1FORM_C; Cell Name: RT-2-TE-YNIVERSAL; CmpIndex: 156; Ref Designator: K10; Symbol name: RT-2-TE_CONNECTIVITI.1; SymIndex: 12; Part Name: RELAY GEN PURPOSE SPDT 16A 5V; Part Number: RT314005
K11 = RELAY GEN PURPOSE SPDT 16A 5V: RT314005; Part Label: 5VDC/16A/400V-1FORM_C; Cell Name: RT-2-TE-YNIVERSAL; CmpIndex: 161; Ref Designator: K11; Symbol name: RT-2-TE_CONNECTIVITI.1; SymIndex: 12; Part Name: RELAY GEN PURPOSE SPDT 16A 5V; Part Number: RT314005
K12 = RELAY GEN PURPOSE SPDT 16A 5V: RT314005; Part Label: 5VDC/16A/400V-1FORM_C; Cell Name: RT-2-TE-YNIVERSAL; CmpIndex: 166; Ref Designator: K12; Symbol name: RT-2-TE_CONNECTIVITI.1; SymIndex: 12; Part Name: RELAY GEN PURPOSE SPDT 16A 5V; Part Number: RT314005
K13 = RELAY GEN PURPOSE SPDT 16A 5V: RT314005; Part Label: 5VDC/16A/400V-1FORM_C; Cell Name: RT-2-TE-YNIVERSAL; CmpIndex: 536; Ref Designator: K13; Symbol name: RT-2-TE_CONNECTIVITI.1; SymIndex: 12; Part Name: RELAY GEN PURPOSE SPDT 16A 5V; Part Number: RT314005
K14 = RELAY GEN PURPOSE SPDT 16A 5V: RT314005; Part Label: 5VDC/16A/400V-1FORM_C; Cell Name: RT-2-TE-YNIVERSAL; CmpIndex: 594; Ref Designator: K14; Symbol name: RT-2-TE_CONNECTIVITI.1; SymIndex: 12; Part Name: RELAY GEN PURPOSE SPDT 16A 5V; Part Number: RT314005
K15 = RELAY GEN PURPOSE SPDT 16A 5V: RT314005; Part Label: 5VDC/16A/400V-1FORM_C; Cell Name: RT-2-TE-YNIVERSAL; CmpIndex: 598; Ref Designator: K15; Symbol name: RT-2-TE_CONNECTIVITI.1; SymIndex: 12; Part Name: RELAY GEN PURPOSE SPDT 16A 5V; Part Number: RT314005
K16 = RELAY GEN PURPOSE SPDT 16A 5V: RT314005; Part Label: 5VDC/16A/400V-1FORM_C; Cell Name: RT-2-TE-YNIVERSAL; CmpIndex: 611; Ref Designator: K16; Symbol name: RT-2-TE_CONNECTIVITI.1; SymIndex: 12; Part Name: RELAY GEN PURPOSE SPDT 16A 5V; Part Number: RT314005
R1 = RES 0.1 OHM 1% 2W 2512: CRM2512-FX-R100ELF; Part Label: 0.1R; Cell Name: 2512-STANDART-6332; CmpIndex: 11; Ref Designator: R1; Symbol name: R-SXEM-1.1; SymIndex: 1; Part Name: RES 0.1 OHM 1% 2W 2512; Part Number: CRM2512-FX-R100ELF
R2 = RES 0.1 OHM 1% 2W 2512: CRM2512-FX-R100ELF; Part Label: 0.1R; Cell Name: 2512-STANDART-6332; CmpIndex: 15; Ref Designator: R2; Symbol name: R-SXEM-1.1; SymIndex: 1; Part Name: RES 0.1 OHM 1% 2W 2512; Part Number: CRM2512-FX-R100ELF
R3 = RES 0.1 OHM 1% 2W 2512: CRM2512-FX-R100ELF; Part Label: 0.1R; Cell Name: 2512-STANDART-6332; CmpIndex: 16; Ref Designator: R3; Symbol name: R-SXEM-1.1; SymIndex: 1; Part Name: RES 0.1 OHM 1% 2W 2512; Part Number: CRM2512-FX-R100ELF
R4 = RES 0.1 OHM 1% 2W 2512: CRM2512-FX-R100ELF; Part Label: 0.1R; Cell Name: 2512-STANDART-6332; CmpIndex: 29; Ref Designator: R4; Symbol name: R-SXEM-1.1; SymIndex: 1; Part Name: RES 0.1 OHM 1% 2W 2512; Part Number: CRM2512-FX-R100ELF
R5 = RES 0.1 OHM 1% 2W 2512: CRM2512-FX-R100ELF; Part Label: 0.1R; Cell Name: 2512-STANDART-6332; CmpIndex: 30; Ref Designator: R5; Symbol name: R-SXEM-1.1; SymIndex: 1; Part Name: RES 0.1 OHM 1% 2W 2512; Part Number: CRM2512-FX-R100ELF
R6 = RES 0.1 OHM 1% 2W 2512: CRM2512-FX-R100ELF; Part Label: 0.1R; Cell Name: 2512-STANDART-6332; CmpIndex: 35; Ref Designator: R6; Symbol name: R-SXEM-1.1; SymIndex: 1; Part Name: RES 0.1 OHM 1% 2W 2512; Part Number: CRM2512-FX-R100ELF
R7 = RES 0.1 OHM 1% 2W 2512: CRM2512-FX-R100ELF; Part Label: 0.1R; Cell Name: 2512-STANDART-6332; CmpIndex: 38; Ref Designator: R7; Symbol name: R-SXEM-1.1; SymIndex: 1; Part Name: RES 0.1 OHM 1% 2W 2512; Part Number: CRM2512-FX-R100ELF
R8 = RES 0.1 OHM 1% 2W 2512: CRM2512-FX-R100ELF; Part Label: 0.1R; Cell Name: 2512-STANDART-6332; CmpIndex: 39; Ref Designator: R8; Symbol name: R-SXEM-1.1; SymIndex: 1; Part Name: RES 0.1 OHM 1% 2W 2512; Part Number: CRM2512-FX-R100ELF
R9 = RES 0.1 OHM 1% 2W 2512: CRM2512-FX-R100ELF; Part Label: 0.1R; Cell Name: 2512-STANDART-6332; CmpIndex: 40; Ref Designator: R9; Symbol name: R-SXEM-1.1; SymIndex: 1; Part Name: RES 0.1 OHM 1% 2W 2512; Part Number: CRM2512-FX-R100ELF
R10 = RES 0.1 OHM 1% 2W 2512: CRM2512-FX-R100ELF; Part Label: 0.1R; Cell Name: 2512-STANDART-6332; CmpIndex: 42; Ref Designator: R10; Symbol name: R-SXEM-1.1; SymIndex: 1; Part Name: RES 0.1 OHM 1% 2W 2512; Part Number: CRM2512-FX-R100ELF
R11 = RES 0.1 OHM 1% 2W 2512: CRM2512-FX-R100ELF; Part Label: 0.1R; Cell Name: 2512-STANDART-6332; CmpIndex: 43; Ref Designator: R11; Symbol name: R-SXEM-1.1; SymIndex: 1; Part Name: RES 0.1 OHM 1% 2W 2512; Part Number: CRM2512-FX-R100ELF
R12 = RES 0.1 OHM 1% 2W 2512: CRM2512-FX-R100ELF; Part Label: 0.1R; Cell Name: 2512-STANDART-6332; CmpIndex: 49; Ref Designator: R12; Symbol name: R-SXEM-1.1; SymIndex: 1; Part Name: RES 0.1 OHM 1% 2W 2512; Part Number: CRM2512-FX-R100ELF
R13 = RES 0.1 OHM 1% 2W 2512: CRM2512-FX-R100ELF; Part Label: 0.1R; Cell Name: 2512-STANDART-6332; CmpIndex: 52; Ref Designator: R13; Symbol name: R-SXEM-1.1; SymIndex: 1; Part Name: RES 0.1 OHM 1% 2W 2512; Part Number: CRM2512-FX-R100ELF
R14 = RES 0.1 OHM 1% 2W 2512: CRM2512-FX-R100ELF; Part Label: 0.1R; Cell Name: 2512-STANDART-6332; CmpIndex: 53; Ref Designator: R14; Symbol name: R-SXEM-1.1; SymIndex: 1; Part Name: RES 0.1 OHM 1% 2W 2512; Part Number: CRM2512-FX-R100ELF
R15 = RES 0.1 OHM 1% 2W 2512: CRM2512-FX-R100ELF; Part Label: 0.1R; Cell Name: 2512-STANDART-6332; CmpIndex: 57; Ref Designator: R15; Symbol name: R-SXEM-1.1; SymIndex: 1; Part Name: RES 0.1 OHM 1% 2W 2512; Part Number: CRM2512-FX-R100ELF
R16 = RES 0.1 OHM 1% 2W 2512: CRM2512-FX-R100ELF; Part Label: 0.1R; Cell Name: 2512-STANDART-6332; CmpIndex: 58; Ref Designator: R16; Symbol name: R-SXEM-1.1; SymIndex: 1; Part Name: RES 0.1 OHM 1% 2W 2512; Part Number: CRM2512-FX-R100ELF
R17 = RES 0.1 OHM 1% 2W 2512: CRM2512-FX-R100ELF; Part Label: 0.1R; Cell Name: 2512-STANDART-6332; CmpIndex: 64; Ref Designator: R17; Symbol name: R-SXEM-1.1; SymIndex: 1; Part Name: RES 0.1 OHM 1% 2W 2512; Part Number: CRM2512-FX-R100ELF
R18 = RES 0.1 OHM 1% 2W 2512: CRM2512-FX-R100ELF; Part Label: 0.1R; Cell Name: 2512-STANDART-6332; CmpIndex: 66; Ref Designator: R18; Symbol name: R-SXEM-1.1; SymIndex: 1; Part Name: RES 0.1 OHM 1% 2W 2512; Part Number: CRM2512-FX-R100ELF
R19 = RES 0.1 OHM 1% 2W 2512: CRM2512-FX-R100ELF; Part Label: 0.1R; Cell Name: 2512-STANDART-6332; CmpIndex: 91; Ref Designator: R19; Symbol name: R-SXEM-1.1; SymIndex: 1; Part Name: RES 0.1 OHM 1% 2W 2512; Part Number: CRM2512-FX-R100ELF
R20 = RES 0.1 OHM 1% 2W 2512: CRM2512-FX-R100ELF; Part Label: 0.1R; Cell Name: 2512-STANDART-6332; CmpIndex: 92; Ref Designator: R20; Symbol name: R-SXEM-1.1; SymIndex: 1; Part Name: RES 0.1 OHM 1% 2W 2512; Part Number: CRM2512-FX-R100ELF
R21 = RES 0.1 OHM 1% 2W 2512: CRM2512-FX-R100ELF; Part Label: 0.1R; Cell Name: 2512-STANDART-6332; CmpIndex: 93; Ref Designator: R21; Symbol name: R-SXEM-1.1; SymIndex: 1; Part Name: RES 0.1 OHM 1% 2W 2512; Part Number: CRM2512-FX-R100ELF
R22 = RES 0.1 OHM 1% 2W 2512: CRM2512-FX-R100ELF; Part Label: 0.1R; Cell Name: 2512-STANDART-6332; CmpIndex: 94; Ref Designator: R22; Symbol name: R-SXEM-1.1; SymIndex: 1; Part Name: RES 0.1 OHM 1% 2W 2512; Part Number: CRM2512-FX-R100ELF
R23 = RES 0.1 OHM 1% 2W 2512: CRM2512-FX-R100ELF; Part Label: 0.1R; Cell Name: 2512-STANDART-6332; CmpIndex: 95; Ref Designator: R23; Symbol name: R-SXEM-1.1; SymIndex: 1; Part Name: RES 0.1 OHM 1% 2W 2512; Part Number: CRM2512-FX-R100ELF
R24 = RES 0.1 OHM 1% 2W 2512: CRM2512-FX-R100ELF; Part Label: 0.1R; Cell Name: 2512-STANDART-6332; CmpIndex: 97; Ref Designator: R24; Symbol name: R-SXEM-1.1; SymIndex: 1; Part Name: RES 0.1 OHM 1% 2W 2512; Part Number: CRM2512-FX-R100ELF
R25 = RES 0.1 OHM 1% 2W 2512: CRM2512-FX-R100ELF; Part Label: 0.1R; Cell Name: 2512-STANDART-6332; CmpIndex: 98; Ref Designator: R25; Symbol name: R-SXEM-1.1; SymIndex: 1; Part Name: RES 0.1 OHM 1% 2W 2512; Part Number: CRM2512-FX-R100ELF
R26 = RES 0.1 OHM 1% 2W 2512: CRM2512-FX-R100ELF; Part Label: 0.1R; Cell Name: 2512-STANDART-6332; CmpIndex: 147; Ref Designator: R26; Symbol name: R-SXEM-1.1; SymIndex: 1; Part Name: RES 0.1 OHM 1% 2W 2512; Part Number: CRM2512-FX-R100ELF
R27 = RES 0.1 OHM 1% 2W 2512: CRM2512-FX-R100ELF; Part Label: 0.1R; Cell Name: 2512-STANDART-6332; CmpIndex: 148; Ref Designator: R27; Symbol name: R-SXEM-1.1; SymIndex: 1; Part Name: RES 0.1 OHM 1% 2W 2512; Part Number: CRM2512-FX-R100ELF
R28 = RES 0.1 OHM 1% 2W 2512: CRM2512-FX-R100ELF; Part Label: 0.1R; Cell Name: 2512-STANDART-6332; CmpIndex: 152; Ref Designator: R28; Symbol name: R-SXEM-1.1; SymIndex: 1; Part Name: RES 0.1 OHM 1% 2W 2512; Part Number: CRM2512-FX-R100ELF
R29 = RES 0.1 OHM 1% 2W 2512: CRM2512-FX-R100ELF; Part Label: 0.1R; Cell Name: 2512-STANDART-6332; CmpIndex: 153; Ref Designator: R29; Symbol name: R-SXEM-1.1; SymIndex: 1; Part Name: RES 0.1 OHM 1% 2W 2512; Part Number: CRM2512-FX-R100ELF
R30 = RES 0.1 OHM 1% 2W 2512: CRM2512-FX-R100ELF; Part Label: 0.1R; Cell Name: 2512-STANDART-6332; CmpIndex: 157; Ref Designator: R30; Symbol name: R-SXEM-1.1; SymIndex: 1; Part Name: RES 0.1 OHM 1% 2W 2512; Part Number: CRM2512-FX-R100ELF
R31 = RES 0.1 OHM 1% 2W 2512: CRM2512-FX-R100ELF; Part Label: 0.1R; Cell Name: 2512-STANDART-6332; CmpIndex: 158; Ref Designator: R31; Symbol name: R-SXEM-1.1; SymIndex: 1; Part Name: RES 0.1 OHM 1% 2W 2512; Part Number: CRM2512-FX-R100ELF
R32 = RES 0.1 OHM 1% 2W 2512: CRM2512-FX-R100ELF; Part Label: 0.1R; Cell Name: 2512-STANDART-6332; CmpIndex: 162; Ref Designator: R32; Symbol name: R-SXEM-1.1; SymIndex: 1; Part Name: RES 0.1 OHM 1% 2W 2512; Part Number: CRM2512-FX-R100ELF
R33 = RES 0.1 OHM 1% 2W 2512: CRM2512-FX-R100ELF; Part Label: 0.1R; Cell Name: 2512-STANDART-6332; CmpIndex: 45; Ref Designator: R33; Symbol name: R-SXEM-1.1; SymIndex: 1; Part Name: RES 0.1 OHM 1% 2W 2512; Part Number: CRM2512-FX-R100ELF
R34 = RES 0.1 OHM 1% 2W 2512: CRM2512-FX-R100ELF; Part Label: 0.1R; Cell Name: 2512-STANDART-6332; CmpIndex: 34; Ref Designator: R34; Symbol name: R-SXEM-1.1; SymIndex: 1; Part Name: RES 0.1 OHM 1% 2W 2512; Part Number: CRM2512-FX-R100ELF
R126 = RES 620 OHM 1/10W 1% 0603 SMD: ERJ-3EKF6200V; Part Label: 620R; Cell Name: 0603-STANDART-1608; CmpIndex: 195; Ref Designator: R126; Symbol name: R-SXEM-1.1; SymIndex: 1; Part Name: RES 620 OHM 1/10W 1% 0603 SMD; Part Number: ERJ-3EKF6200V
R127 = RES 620 OHM 1/10W 1% 0603 SMD: ERJ-3EKF6200V; Part Label: 620R; Cell Name: 0603-STANDART-1608; CmpIndex: 196; Ref Designator: R127; Symbol name: R-SXEM-1.1; SymIndex: 1; Part Name: RES 620 OHM 1/10W 1% 0603 SMD; Part Number: ERJ-3EKF6200V
R128 = RES 620 OHM 1/10W 1% 0603 SMD: ERJ-3EKF6200V; Part Label: 620R; Cell Name: 0603-STANDART-1608; CmpIndex: 197; Ref Designator: R128; Symbol name: R-SXEM-1.1; SymIndex: 1; Part Name: RES 620 OHM 1/10W 1% 0603 SMD; Part Number: ERJ-3EKF6200V
R129 = RES 620 OHM 1/10W 1% 0603 SMD: ERJ-3EKF6200V; Part Label: 620R; Cell Name: 0603-STANDART-1608; CmpIndex: 198; Ref Designator: R129; Symbol name: R-SXEM-1.1; SymIndex: 1; Part Name: RES 620 OHM 1/10W 1% 0603 SMD; Part Number: ERJ-3EKF6200V
R130 = RES 620 OHM 1/10W 1% 0603 SMD: ERJ-3EKF6200V; Part Label: 620R; Cell Name: 0603-STANDART-1608; CmpIndex: 199; Ref Designator: R130; Symbol name: R-SXEM-1.1; SymIndex: 1; Part Name: RES 620 OHM 1/10W 1% 0603 SMD; Part Number: ERJ-3EKF6200V
R131 = RES 620 OHM 1/10W 1% 0603 SMD: ERJ-3EKF6200V; Part Label: 620R; Cell Name: 0603-STANDART-1608; CmpIndex: 200; Ref Designator: R131; Symbol name: R-SXEM-1.1; SymIndex: 1; Part Name: RES 620 OHM 1/10W 1% 0603 SMD; Part Number: ERJ-3EKF6200V
R132 = RES 620 OHM 1/10W 1% 0603 SMD: ERJ-3EKF6200V; Part Label: 620R; Cell Name: 0603-STANDART-1608; CmpIndex: 201; Ref Designator: R132; Symbol name: R-SXEM-1.1; SymIndex: 1; Part Name: RES 620 OHM 1/10W 1% 0603 SMD; Part Number: ERJ-3EKF6200V
R133 = RES 620 OHM 1/10W 1% 0603 SMD: ERJ-3EKF6200V; Part Label: 620R; Cell Name: 0603-STANDART-1608; CmpIndex: 202; Ref Designator: R133; Symbol name: R-SXEM-1.1; SymIndex: 1; Part Name: RES 620 OHM 1/10W 1% 0603 SMD; Part Number: ERJ-3EKF6200V
R134 = RES 620 OHM 1/10W 1% 0603 SMD: ERJ-3EKF6200V; Part Label: 620R; Cell Name: 0603-STANDART-1608; CmpIndex: 203; Ref Designator: R134; Symbol name: R-SXEM-1.1; SymIndex: 1; Part Name: RES 620 OHM 1/10W 1% 0603 SMD; Part Number: ERJ-3EKF6200V
R135 = RES 620 OHM 1/10W 1% 0603 SMD: ERJ-3EKF6200V; Part Label: 620R; Cell Name: 0603-STANDART-1608; CmpIndex: 204; Ref Designator: R135; Symbol name: R-SXEM-1.1; SymIndex: 1; Part Name: RES 620 OHM 1/10W 1% 0603 SMD; Part Number: ERJ-3EKF6200V
R136 = RES 620 OHM 1/10W 1% 0603 SMD: ERJ-3EKF6200V; Part Label: 620R; Cell Name: 0603-STANDART-1608; CmpIndex: 205; Ref Designator: R136; Symbol name: R-SXEM-1.1; SymIndex: 1; Part Name: RES 620 OHM 1/10W 1% 0603 SMD; Part Number: ERJ-3EKF6200V
R137 = RES 620 OHM 1/10W 1% 0603 SMD: ERJ-3EKF6200V; Part Label: 620R; Cell Name: 0603-STANDART-1608; CmpIndex: 206; Ref Designator: R137; Symbol name: R-SXEM-1.1; SymIndex: 1; Part Name: RES 620 OHM 1/10W 1% 0603 SMD; Part Number: ERJ-3EKF6200V
R138 = RES 620 OHM 1/10W 1% 0603 SMD: ERJ-3EKF6200V; Part Label: 620R; Cell Name: 0603-STANDART-1608; CmpIndex: 207; Ref Designator: R138; Symbol name: R-SXEM-1.1; SymIndex: 1; Part Name: RES 620 OHM 1/10W 1% 0603 SMD; Part Number: ERJ-3EKF6200V
R139 = RES 620 OHM 1/10W 1% 0603 SMD: ERJ-3EKF6200V; Part Label: 620R; Cell Name: 0603-STANDART-1608; CmpIndex: 208; Ref Designator: R139; Symbol name: R-SXEM-1.1; SymIndex: 1; Part Name: RES 620 OHM 1/10W 1% 0603 SMD; Part Number: ERJ-3EKF6200V
R140 = RES 620 OHM 1/10W 1% 0603 SMD: ERJ-3EKF6200V; Part Label: 620R; Cell Name: 0603-STANDART-1608; CmpIndex: 209; Ref Designator: R140; Symbol name: R-SXEM-1.1; SymIndex: 1; Part Name: RES 620 OHM 1/10W 1% 0603 SMD; Part Number: ERJ-3EKF6200V
R141 = RES 620 OHM 1/10W 1% 0603 SMD: ERJ-3EKF6200V; Part Label: 620R; Cell Name: 0603-STANDART-1608; CmpIndex: 264; Ref Designator: R141; Symbol name: R-SXEM-1.1; SymIndex: 1; Part Name: RES 620 OHM 1/10W 1% 0603 SMD; Part Number: ERJ-3EKF6200V
TP1 = TEST POINT PC MULTI PURPOSE BLK: 5011; Cell Name: TEST-POINTS-1; CmpIndex: 4; Ref Designator: TP1; Symbol name: TEST-POINTS-4.1; SymIndex: 9; Part Name: TEST POINT PC MULTI PURPOSE BLK; Part Number: 5011
TP2 = TEST POINT PC MULTI PURPOSE BLK: 5011; Cell Name: TEST-POINTS-1; CmpIndex: 5; Ref Designator: TP2; Symbol name: TEST-POINTS-4.1; SymIndex: 9; Part Name: TEST POINT PC MULTI PURPOSE BLK; Part Number: 5011
TP3 = TEST POINT PC MULTI PURPOSE BLK: 5011; Cell Name: TEST-POINTS-1; CmpIndex: 6; Ref Designator: TP3; Symbol name: TEST-POINTS-4.1; SymIndex: 9; Part Name: TEST POINT PC MULTI PURPOSE BLK; Part Number: 5011
TP4 = TEST POINT PC MULTI PURPOSE BLK: 5011; Cell Name: TEST-POINTS-1; CmpIndex: 10; Ref Designator: TP4; Symbol name: TEST-POINTS-4.1; SymIndex: 9; Part Name: TEST POINT PC MULTI PURPOSE BLK; Part Number: 5011
TP11 = TEST POINT PC MULTIPURPOSE BRWN: 5125; Cell Name: TEST-POINTS-1; CmpIndex: 750; Ref Designator: TP11; Symbol name: TEST-POINTS-4.1; SymIndex: 9; Part Name: TEST POINT PC MULTIPURPOSE BRWN; Part Number: 5125
TP12 = TEST POINT PC MULTIPURPOSE BRWN: 5125; Cell Name: TEST-POINTS-1; CmpIndex: 614; Ref Designator: TP12; Symbol name: TEST-POINTS-4.1; SymIndex: 9; Part Name: TEST POINT PC MULTIPURPOSE BRWN; Part Number: 5125
TP13 = TEST POINT PC MULTIPURPOSE BRWN: 5125; Cell Name: TEST-POINTS-1; CmpIndex: 595; Ref Designator: TP13; Symbol name: TEST-POINTS-4.1; SymIndex: 9; Part Name: TEST POINT PC MULTIPURPOSE BRWN; Part Number: 5125
TP14 = TEST POINT PC MULTIPURPOSE BRWN: 5125; Cell Name: TEST-POINTS-1; CmpIndex: 605; Ref Designator: TP14; Symbol name: TEST-POINTS-4.1; SymIndex: 9; Part Name: TEST POINT PC MULTIPURPOSE BRWN; Part Number: 5125
TP15 = TEST POINT PC MULTIPURPOSE BRWN: 5125; Cell Name: TEST-POINTS-1; CmpIndex: 612; Ref Designator: TP15; Symbol name: TEST-POINTS-4.1; SymIndex: 9; Part Name: TEST POINT PC MULTIPURPOSE BRWN; Part Number: 5125
TP16 = TEST POINT PC MULTIPURPOSE BRWN: 5125; Cell Name: TEST-POINTS-1; CmpIndex: 620; Ref Designator: TP16; Symbol name: TEST-POINTS-4.1; SymIndex: 9; Part Name: TEST POINT PC MULTIPURPOSE BRWN; Part Number: 5125
TP17 = TEST POINT PC MULTIPURPOSE BRWN: 5125; Cell Name: TEST-POINTS-1; CmpIndex: 626; Ref Designator: TP17; Symbol name: TEST-POINTS-4.1; SymIndex: 9; Part Name: TEST POINT PC MULTIPURPOSE BRWN; Part Number: 5125
TP18 = TEST POINT PC MULTIPURPOSE BRWN: 5125; Cell Name: TEST-POINTS-1; CmpIndex: 632; Ref Designator: TP18; Symbol name: TEST-POINTS-4.1; SymIndex: 9; Part Name: TEST POINT PC MULTIPURPOSE BRWN; Part Number: 5125
TP19 = TEST POINT PC MULTIPURPOSE BRWN: 5125; Cell Name: TEST-POINTS-1; CmpIndex: 638; Ref Designator: TP19; Symbol name: TEST-POINTS-4.1; SymIndex: 9; Part Name: TEST POINT PC MULTIPURPOSE BRWN; Part Number: 5125
TP20 = TEST POINT PC MULTIPURPOSE BRWN: 5125; Cell Name: TEST-POINTS-1; CmpIndex: 644; Ref Designator: TP20; Symbol name: TEST-POINTS-4.1; SymIndex: 9; Part Name: TEST POINT PC MULTIPURPOSE BRWN; Part Number: 5125
TP21 = TEST POINT PC MULTIPURPOSE BRWN: 5125; Cell Name: TEST-POINTS-1; CmpIndex: 650; Ref Designator: TP21; Symbol name: TEST-POINTS-4.1; SymIndex: 9; Part Name: TEST POINT PC MULTIPURPOSE BRWN; Part Number: 5125
TP22 = TEST POINT PC MULTIPURPOSE BRWN: 5125; Cell Name: TEST-POINTS-1; CmpIndex: 656; Ref Designator: TP22; Symbol name: TEST-POINTS-4.1; SymIndex: 9; Part Name: TEST POINT PC MULTIPURPOSE BRWN; Part Number: 5125
TP23 = TEST POINT PC MULTIPURPOSE BRWN: 5125; Cell Name: TEST-POINTS-1; CmpIndex: 662; Ref Designator: TP23; Symbol name: TEST-POINTS-4.1; SymIndex: 9; Part Name: TEST POINT PC MULTIPURPOSE BRWN; Part Number: 5125
TP24 = TEST POINT PC MULTIPURPOSE BRWN: 5125; Cell Name: TEST-POINTS-1; CmpIndex: 668; Ref Designator: TP24; Symbol name: TEST-POINTS-4.1; SymIndex: 9; Part Name: TEST POINT PC MULTIPURPOSE BRWN; Part Number: 5125
TP25 = TEST POINT PC MULTIPURPOSE BRWN: 5125; Cell Name: TEST-POINTS-1; CmpIndex: 674; Ref Designator: TP25; Symbol name: TEST-POINTS-4.1; SymIndex: 9; Part Name: TEST POINT PC MULTIPURPOSE BRWN; Part Number: 5125
TP26 = TEST POINT PC MULTIPURPOSE BRWN: 5125; Cell Name: TEST-POINTS-1; CmpIndex: 680; Ref Designator: TP26; Symbol name: TEST-POINTS-4.1; SymIndex: 9; Part Name: TEST POINT PC MULTIPURPOSE BRWN; Part Number: 5125
TP27 = TEST POINT PC MULTIPURPOSE BRWN: 5125; Cell Name: TEST-POINTS-1; CmpIndex: 686; Ref Designator: TP27; Symbol name: TEST-POINTS-4.1; SymIndex: 9; Part Name: TEST POINT PC MULTIPURPOSE BRWN; Part Number: 5125
TP33 = TEST POINT PC MULTI PURPOSE ORG: 5013; Cell Name: TEST-POINTS-1; CmpIndex: 589; Ref Designator: TP33; Symbol name: TEST-POINTS-4.1; SymIndex: 9; Part Name: TEST POINT PC MULTI PURPOSE ORG; Part Number: 5013
TP34 = TEST POINT PC MULTI PURPOSE ORG: 5013; Cell Name: TEST-POINTS-1; CmpIndex: 748; Ref Designator: TP34; Symbol name: TEST-POINTS-4.1; SymIndex: 9; Part Name: TEST POINT PC MULTI PURPOSE ORG; Part Number: 5013
TP35 = TEST POINT PC MULTI PURPOSE ORG: 5013; Cell Name: TEST-POINTS-1; CmpIndex: 590; Ref Designator: TP35; Symbol name: TEST-POINTS-4.1; SymIndex: 9; Part Name: TEST POINT PC MULTI PURPOSE ORG; Part Number: 5013
TP36 = TEST POINT PC MULTI PURPOSE ORG: 5013; Cell Name: TEST-POINTS-1; CmpIndex: 602; Ref Designator: TP36; Symbol name: TEST-POINTS-4.1; SymIndex: 9; Part Name: TEST POINT PC MULTI PURPOSE ORG; Part Number: 5013
TP37 = TEST POINT PC MULTI PURPOSE ORG: 5013; Cell Name: TEST-POINTS-1; CmpIndex: 608; Ref Designator: TP37; Symbol name: TEST-POINTS-4.1; SymIndex: 9; Part Name: TEST POINT PC MULTI PURPOSE ORG; Part Number: 5013
TP38 = TEST POINT PC MULTI PURPOSE ORG: 5013; Cell Name: TEST-POINTS-1; CmpIndex: 617; Ref Designator: TP38; Symbol name: TEST-POINTS-4.1; SymIndex: 9; Part Name: TEST POINT PC MULTI PURPOSE ORG; Part Number: 5013
TP39 = TEST POINT PC MULTI PURPOSE ORG: 5013; Cell Name: TEST-POINTS-1; CmpIndex: 623; Ref Designator: TP39; Symbol name: TEST-POINTS-4.1; SymIndex: 9; Part Name: TEST POINT PC MULTI PURPOSE ORG; Part Number: 5013
TP40 = TEST POINT PC MULTI PURPOSE ORG: 5013; Cell Name: TEST-POINTS-1; CmpIndex: 629; Ref Designator: TP40; Symbol name: TEST-POINTS-4.1; SymIndex: 9; Part Name: TEST POINT PC MULTI PURPOSE ORG; Part Number: 5013
TP41 = TEST POINT PC MULTI PURPOSE ORG: 5013; Cell Name: TEST-POINTS-1; CmpIndex: 635; Ref Designator: TP41; Symbol name: TEST-POINTS-4.1; SymIndex: 9; Part Name: TEST POINT PC MULTI PURPOSE ORG; Part Number: 5013
TP42 = TEST POINT PC MULTI PURPOSE ORG: 5013; Cell Name: TEST-POINTS-1; CmpIndex: 641; Ref Designator: TP42; Symbol name: TEST-POINTS-4.1; SymIndex: 9; Part Name: TEST POINT PC MULTI PURPOSE ORG; Part Number: 5013
TP43 = TEST POINT PC MULTI PURPOSE ORG: 5013; Cell Name: TEST-POINTS-1; CmpIndex: 647; Ref Designator: TP43; Symbol name: TEST-POINTS-4.1; SymIndex: 9; Part Name: TEST POINT PC MULTI PURPOSE ORG; Part Number: 5013
TP44 = TEST POINT PC MULTI PURPOSE ORG: 5013; Cell Name: TEST-POINTS-1; CmpIndex: 653; Ref Designator: TP44; Symbol name: TEST-POINTS-4.1; SymIndex: 9; Part Name: TEST POINT PC MULTI PURPOSE ORG; Part Number: 5013
TP45 = TEST POINT PC MULTI PURPOSE ORG: 5013; Cell Name: TEST-POINTS-1; CmpIndex: 659; Ref Designator: TP45; Symbol name: TEST-POINTS-4.1; SymIndex: 9; Part Name: TEST POINT PC MULTI PURPOSE ORG; Part Number: 5013
TP46 = TEST POINT PC MULTI PURPOSE ORG: 5013; Cell Name: TEST-POINTS-1; CmpIndex: 665; Ref Designator: TP46; Symbol name: TEST-POINTS-4.1; SymIndex: 9; Part Name: TEST POINT PC MULTI PURPOSE ORG; Part Number: 5013
TP47 = TEST POINT PC MULTI PURPOSE ORG: 5013; Cell Name: TEST-POINTS-1; CmpIndex: 671; Ref Designator: TP47; Symbol name: TEST-POINTS-4.1; SymIndex: 9; Part Name: TEST POINT PC MULTI PURPOSE ORG; Part Number: 5013
TP48 = TEST POINT PC MULTI PURPOSE ORG: 5013; Cell Name: TEST-POINTS-1; CmpIndex: 677; Ref Designator: TP48; Symbol name: TEST-POINTS-4.1; SymIndex: 9; Part Name: TEST POINT PC MULTI PURPOSE ORG; Part Number: 5013
TP49 = TEST POINT PC MULTI PURPOSE ORG: 5013; Cell Name: TEST-POINTS-1; CmpIndex: 683; Ref Designator: TP49; Symbol name: TEST-POINTS-4.1; SymIndex: 9; Part Name: TEST POINT PC MULTI PURPOSE ORG; Part Number: 5013
X1 = CONN HEADER 4POS 4.2MM R/A TIN: 0039301040; Part Label: 4K/ANGLE; Cell Name: 2Rx4K_ANGLE; CmpIndex: 163; Ref Designator: X1; Symbol name: MICRO_FIT_4.1; SymIndex: 74; Part Name: CONN HEADER 4POS 4.2MM R/A TIN; Part Number: 0039301040
X2 = CONN HEADER 4POS 4.2MM R/A TIN: 0039301040; Part Label: 4K/ANGLE; Cell Name: 2Rx4K_ANGLE; CmpIndex: 183; Ref Designator: X2; Symbol name: MICRO_FIT_4.1; SymIndex: 74; Part Name: CONN HEADER 4POS 4.2MM R/A TIN; Part Number: 0039301040
X3 = CONN HEADER 4POS 4.2MM R/A TIN: 0039301040; Part Label: 4K/ANGLE; Cell Name: 2Rx4K_ANGLE; CmpIndex: 498; Ref Designator: X3; Symbol name: MICRO_FIT_4.1; SymIndex: 74; Part Name: CONN HEADER 4POS 4.2MM R/A TIN; Part Number: 0039301040
X4 = CONN HEADER 4POS 4.2MM R/A TIN: 0039301040; Part Label: 4K/ANGLE; Cell Name: 2Rx4K_ANGLE; CmpIndex: 499; Ref Designator: X4; Symbol name: MICRO_FIT_4.1; SymIndex: 74; Part Name: CONN HEADER 4POS 4.2MM R/A TIN; Part Number: 0039301040
X5 = CONN HEADER 4POS 4.2MM R/A TIN: 0039301040; Part Label: 4K/ANGLE; Cell Name: 2Rx4K_ANGLE; CmpIndex: 528; Ref Designator: X5; Symbol name: MICRO_FIT_4.1; SymIndex: 74; Part Name: CONN HEADER 4POS 4.2MM R/A TIN; Part Number: 0039301040
X6 = CONN HEADER 4POS 4.2MM R/A TIN: 0039301040; Part Label: 4K/ANGLE; Cell Name: 2Rx4K_ANGLE; CmpIndex: 532; Ref Designator: X6; Symbol name: MICRO_FIT_4.1; SymIndex: 74; Part Name: CONN HEADER 4POS 4.2MM R/A TIN; Part Number: 0039301040
X7 = CONN HEADER 4POS 4.2MM R/A TIN: 0039301040; Part Label: 4K/ANGLE; Cell Name: 2Rx4K_ANGLE; CmpIndex: 537; Ref Designator: X7; Symbol name: MICRO_FIT_4.1; SymIndex: 74; Part Name: CONN HEADER 4POS 4.2MM R/A TIN; Part Number: 0039301040
X8 = CONN HEADER 4POS 4.2MM R/A TIN: 0039301040; Part Label: 4K/ANGLE; Cell Name: 2Rx4K_ANGLE; CmpIndex: 538; Ref Designator: X8; Symbol name: MICRO_FIT_4.1; SymIndex: 74; Part Name: CONN HEADER 4POS 4.2MM R/A TIN; Part Number: 0039301040
X9 = CONN HEADER 4POS 4.2MM R/A TIN: 0039301040; Part Label: 4K/ANGLE; Cell Name: 2Rx4K_ANGLE; CmpIndex: 543; Ref Designator: X9; Symbol name: MICRO_FIT_4.1; SymIndex: 74; Part Name: CONN HEADER 4POS 4.2MM R/A TIN; Part Number: 0039301040
X10 = CONN HEADER 4POS 4.2MM R/A TIN: 0039301040; Part Label: 4K/ANGLE; Cell Name: 2Rx4K_ANGLE; CmpIndex: 545; Ref Designator: X10; Symbol name: MICRO_FIT_4.1; SymIndex: 74; Part Name: CONN HEADER 4POS 4.2MM R/A TIN; Part Number: 0039301040
X11 = CONN HEADER 4POS 4.2MM R/A TIN: 0039301040; Part Label: 4K/ANGLE; Cell Name: 2Rx4K_ANGLE; CmpIndex: 548; Ref Designator: X11; Symbol name: MICRO_FIT_4.1; SymIndex: 74; Part Name: CONN HEADER 4POS 4.2MM R/A TIN; Part Number: 0039301040
X12 = CONN HEADER 4POS 4.2MM R/A TIN: 0039301040; Part Label: 4K/ANGLE; Cell Name: 2Rx4K_ANGLE; CmpIndex: 583; Ref Designator: X12; Symbol name: MICRO_FIT_4.1; SymIndex: 74; Part Name: CONN HEADER 4POS 4.2MM R/A TIN; Part Number: 0039301040
X13 = CONN HEADER 4POS 4.2MM R/A TIN: 0039301040; Part Label: 4K/ANGLE; Cell Name: 2Rx4K_ANGLE; CmpIndex: 591; Ref Designator: X13; Symbol name: MICRO_FIT_4.1; SymIndex: 74; Part Name: CONN HEADER 4POS 4.2MM R/A TIN; Part Number: 0039301040
X14 = CONN HEADER 4POS 4.2MM R/A TIN: 0039301040; Part Label: 4K/ANGLE; Cell Name: 2Rx4K_ANGLE; CmpIndex: 592; Ref Designator: X14; Symbol name: MICRO_FIT_4.1; SymIndex: 74; Part Name: CONN HEADER 4POS 4.2MM R/A TIN; Part Number: 0039301040
X15 = CONN HEADER 4POS 4.2MM R/A TIN: 0039301040; Part Label: 4K/ANGLE; Cell Name: 2Rx4K_ANGLE; CmpIndex: 593; Ref Designator: X15; Symbol name: MICRO_FIT_4.1; SymIndex: 74; Part Name: CONN HEADER 4POS 4.2MM R/A TIN; Part Number: 0039301040
X16 = CONN HEADER 4POS 4.2MM R/A TIN: 0039301040; Part Label: 4K/ANGLE; Cell Name: 2Rx4K_ANGLE; CmpIndex: 596; Ref Designator: X16; Symbol name: MICRO_FIT_4.1; SymIndex: 74; Part Name: CONN HEADER 4POS 4.2MM R/A TIN; Part Number: 0039301040
X19 = CONN HEADER 6POS 4.2MM VERT TIN: 0039281063; Part Label: 6K; Cell Name: 2Rx6K; CmpIndex: 738; Ref Designator: X19; Symbol name: MICRO_FIT_6.1; SymIndex: 57; Part Name: CONN HEADER 6POS 4.2MM VERT TIN; Part Number: 0039281063
X20 = CONN HEADER 6POS 4.2MM VERT TIN: 0039281063; Part Label: 6K; Cell Name: 2Rx6K; CmpIndex: 801; Ref Designator: X20; Symbol name: MICRO_FIT_6.1; SymIndex: 57; Part Name: CONN HEADER 6POS 4.2MM VERT TIN; Part Number: 0039281063

## Sheet Schematic1_3.SchDoc
size 594 x 420 mm; SchematicName: Schematic1; PageName: 3; CmpIndex: 180; Symbol name: A2-LIST-2N-1-GA.1; SymIndex: 3
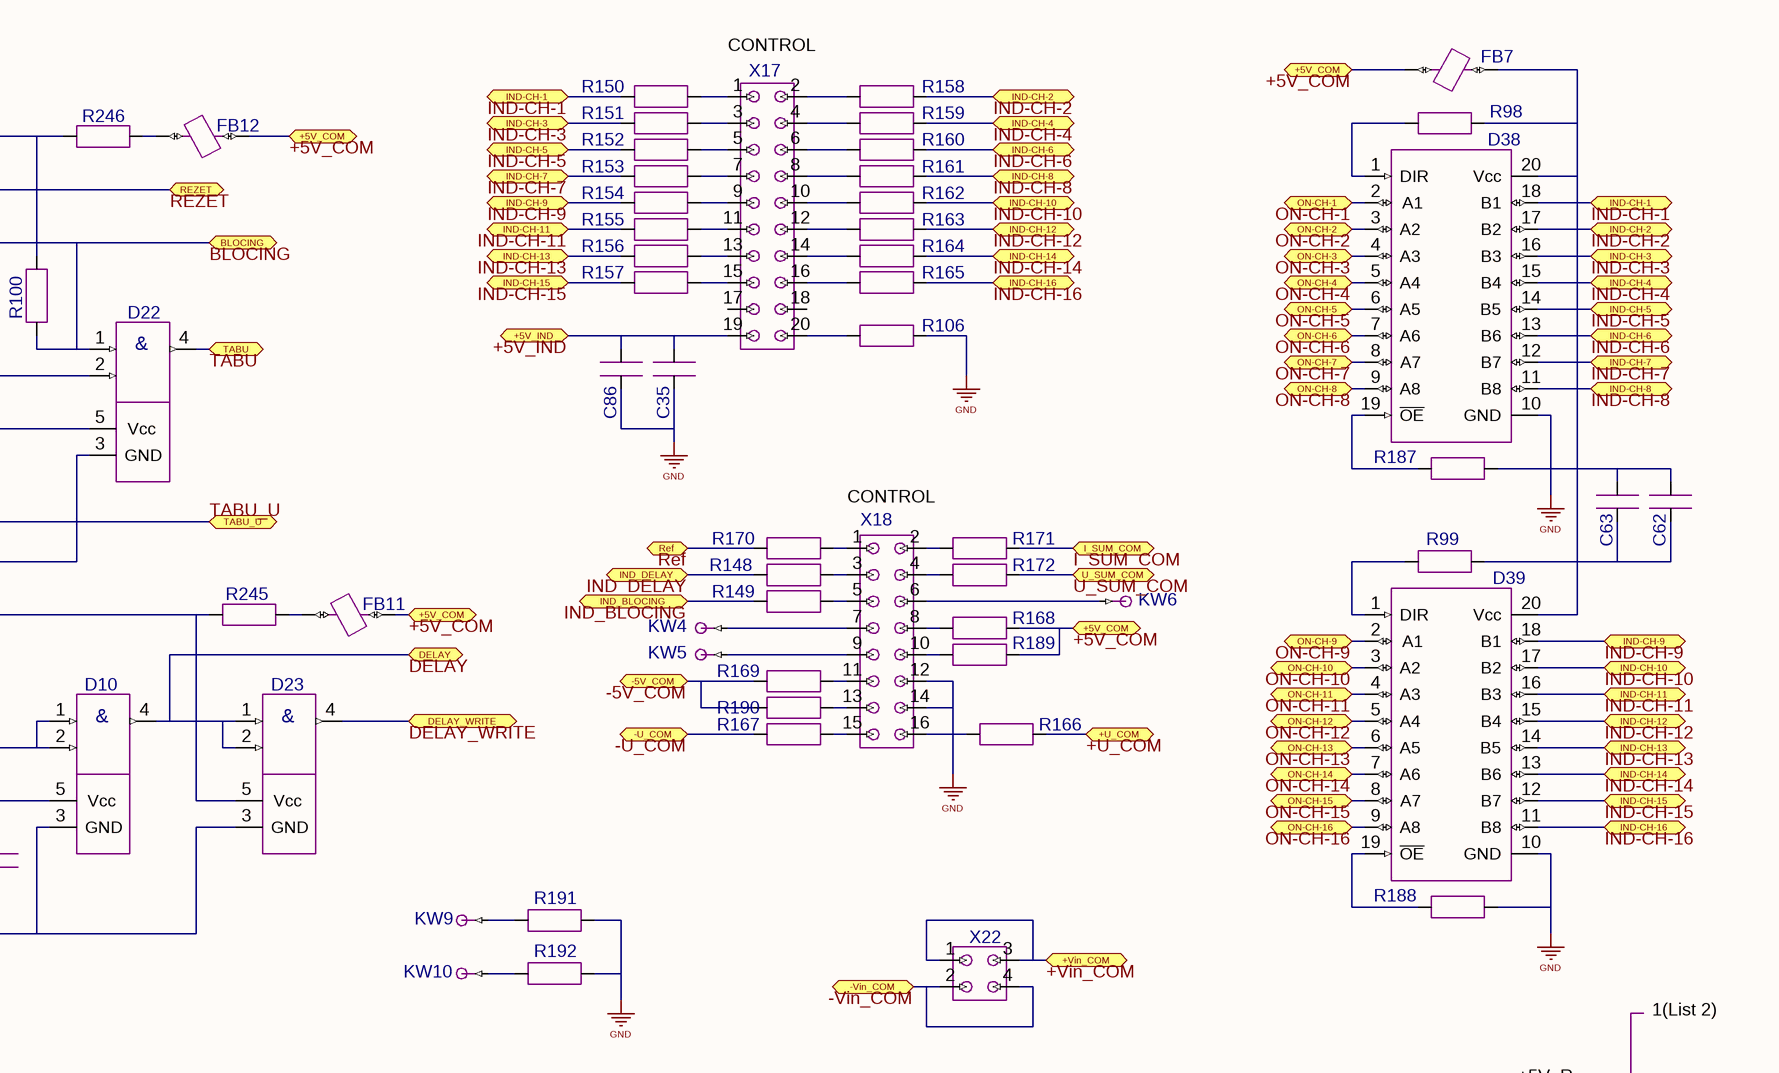
[diagram p9: Schematic1_3.SchDoc, top right]
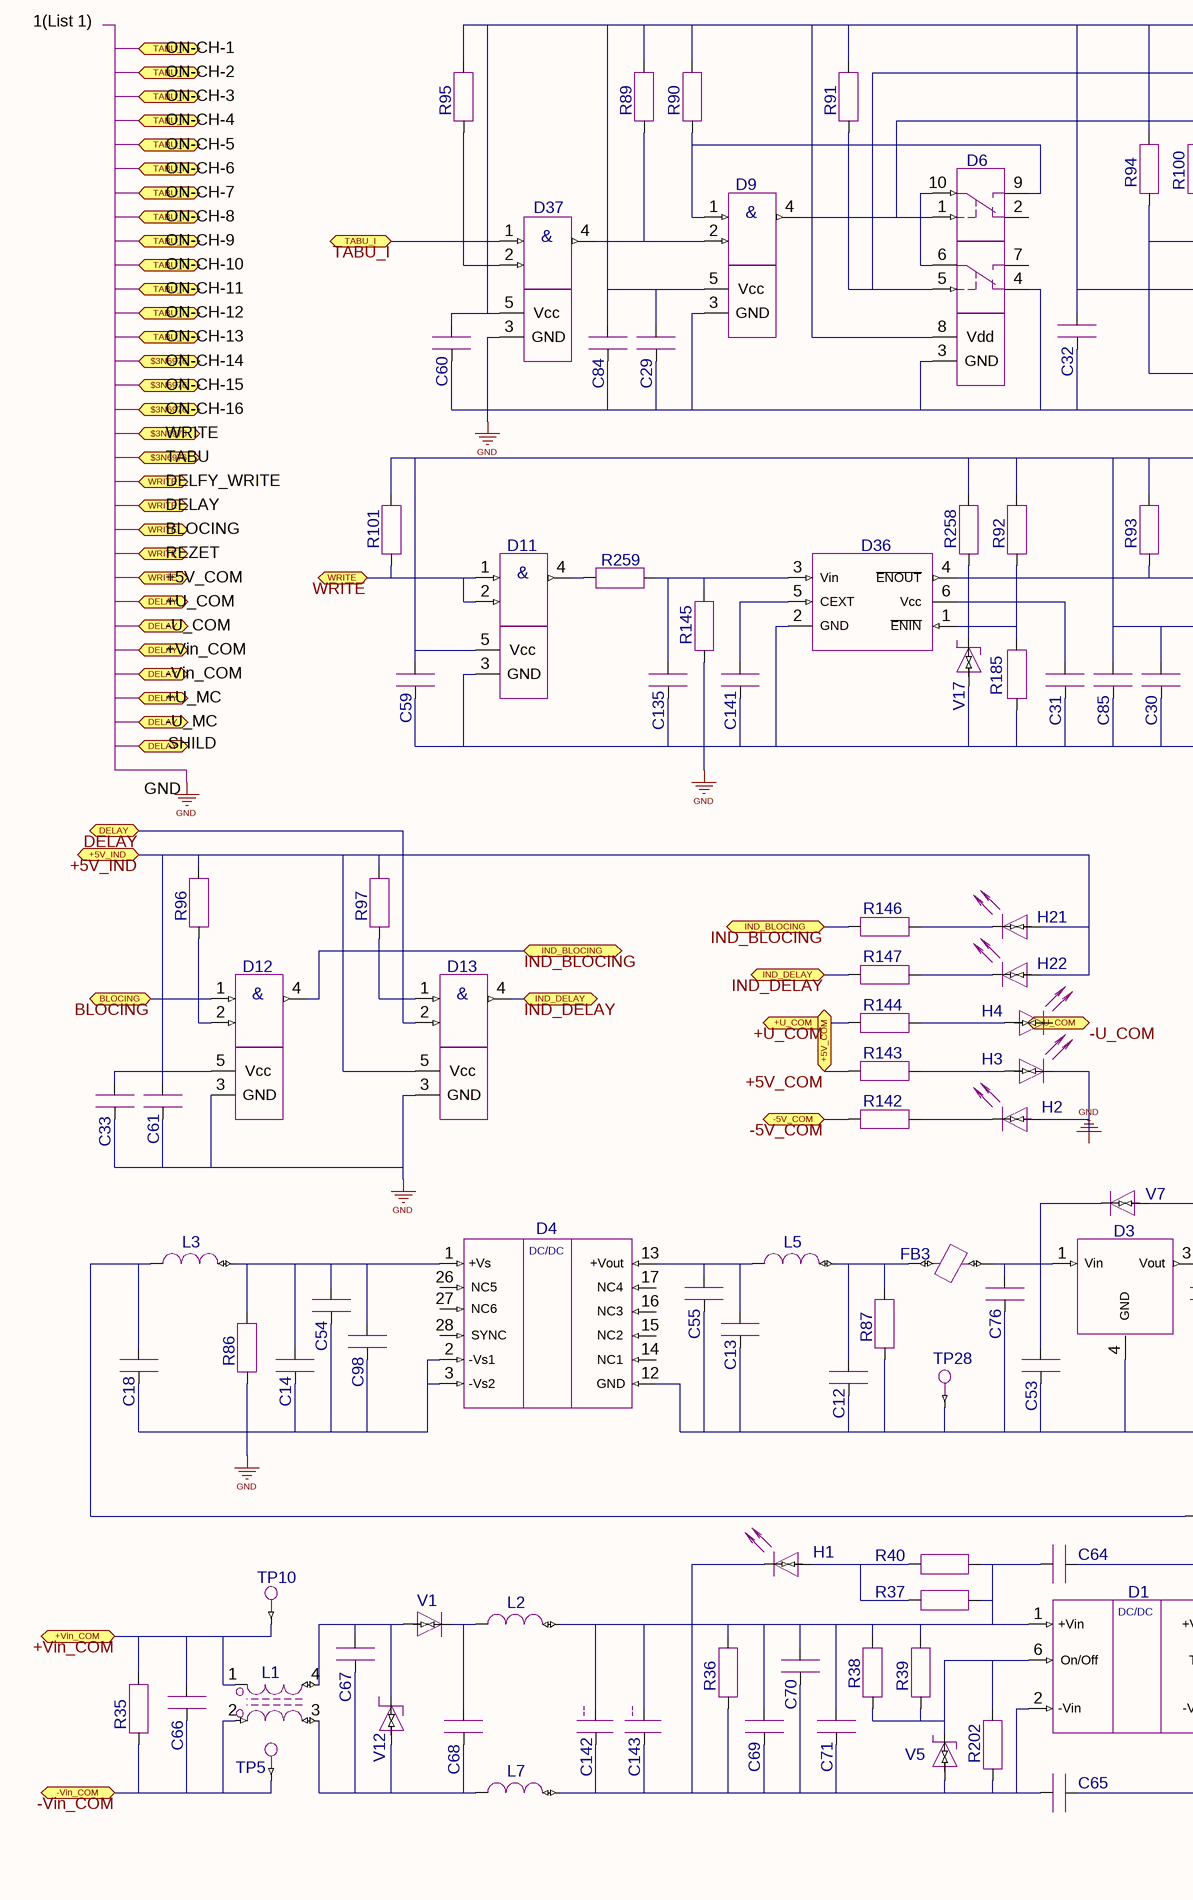
[diagram p10: Schematic1_3.SchDoc, bottom left]
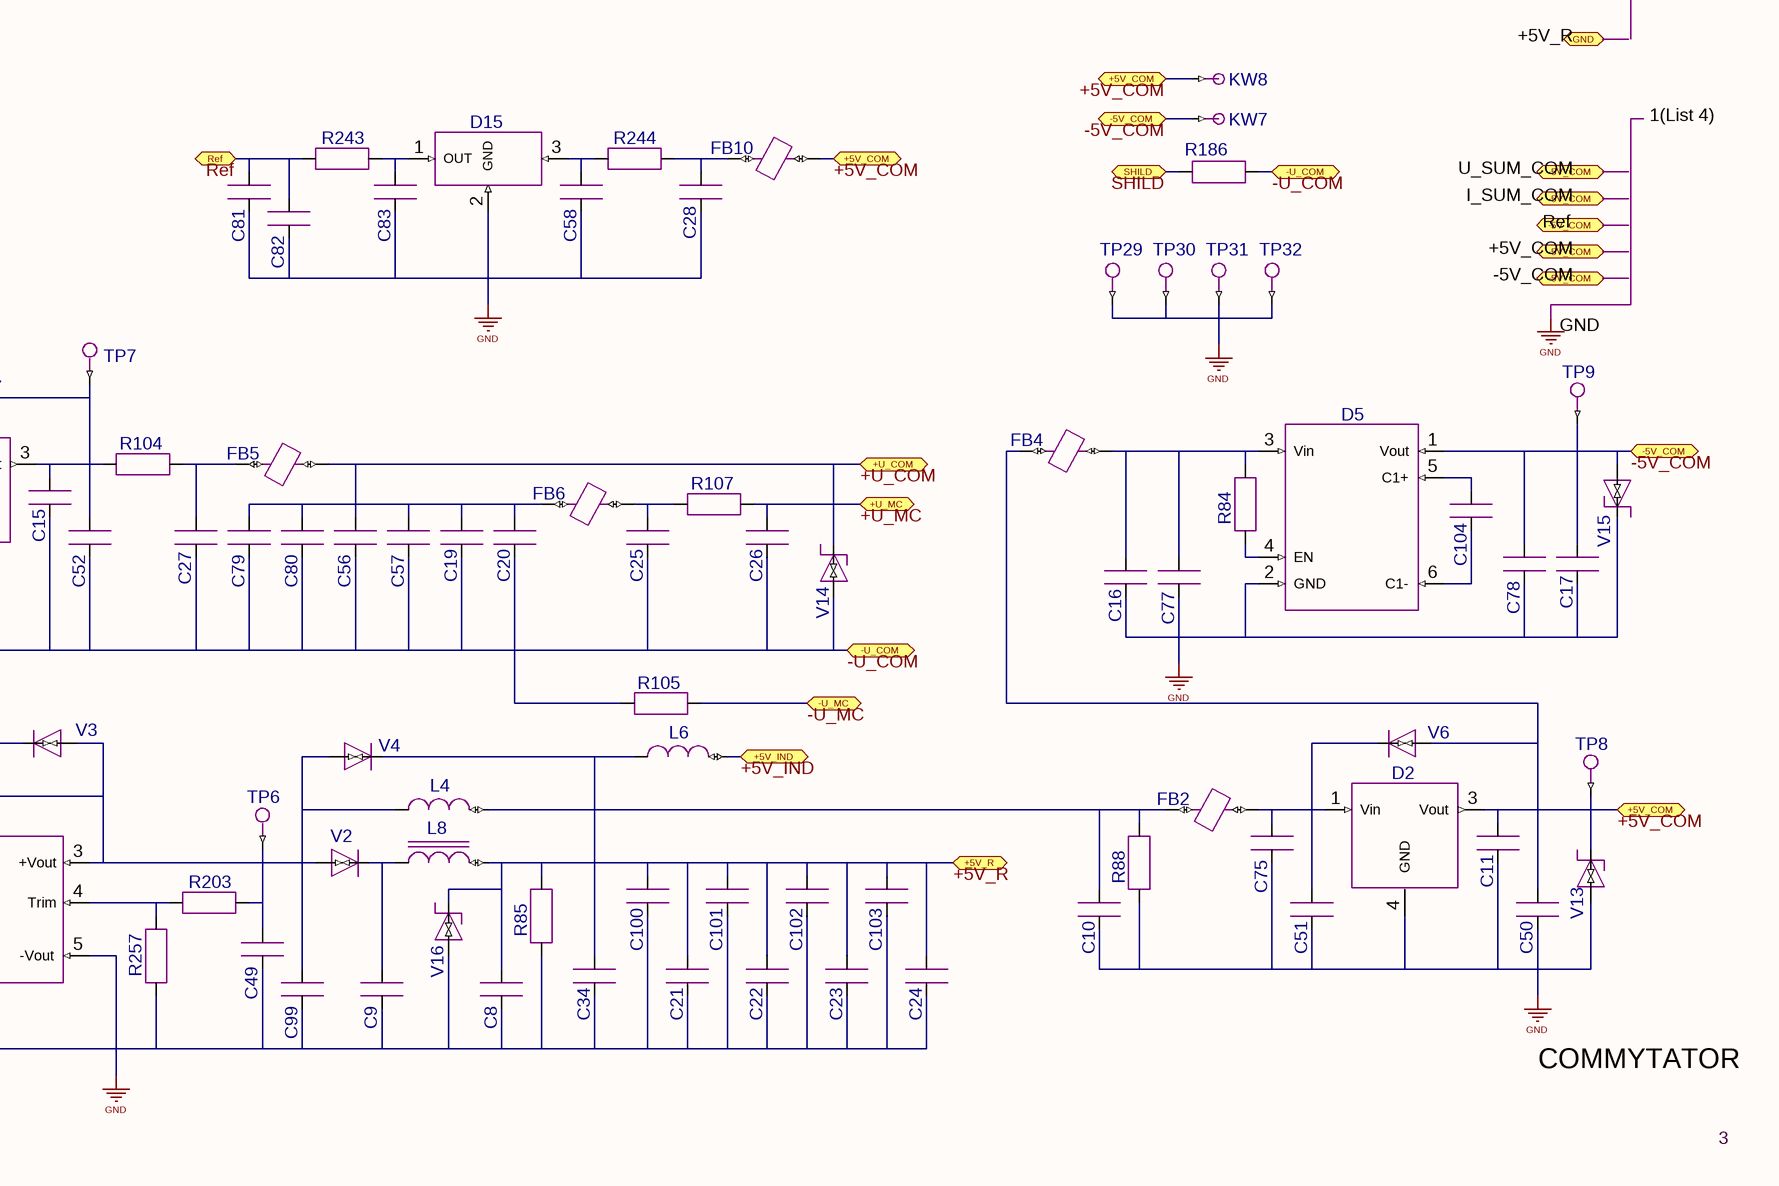
[diagram p11: Schematic1_3.SchDoc, bottom right]